# Altium project RP2350_OPCUA_Node.PrjPcb (part 1 of 2)
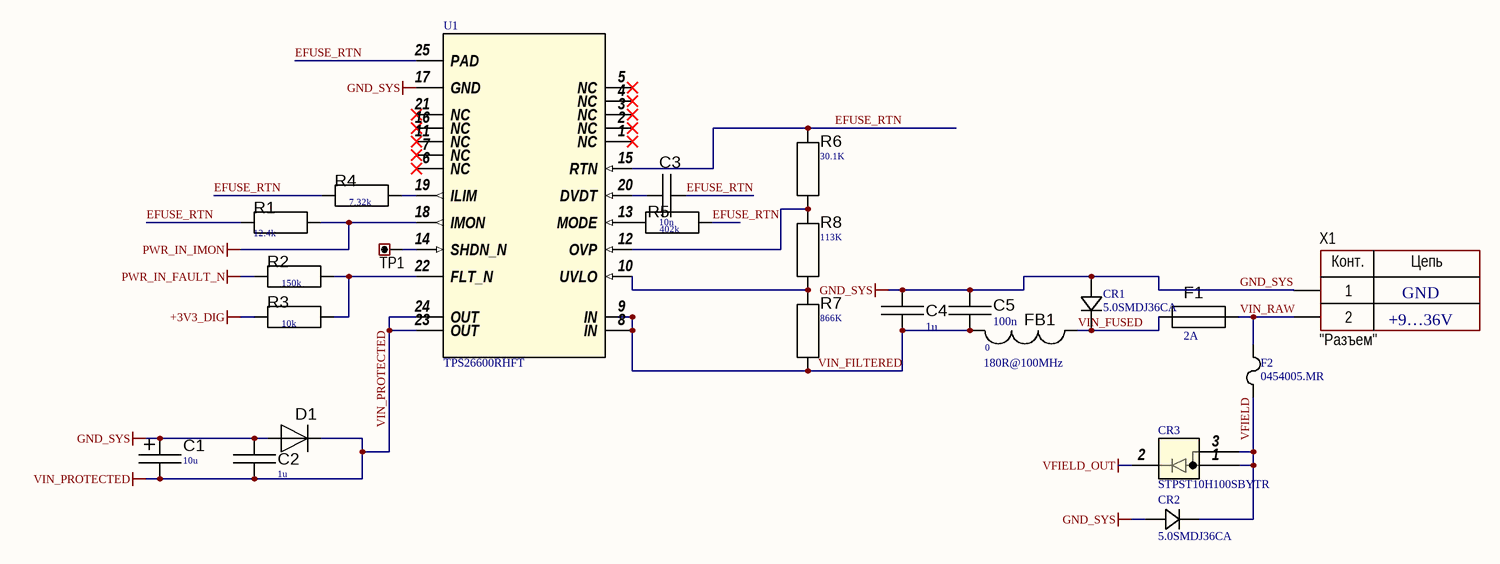
[diagram p0: 01_POWER_INPUT.SchDoc]
11 sheets, 419 parts. Net scope: global (net labels, ports and power ports of the same name join across sheets).
Board file: PCB1.PcbDoc
Sheets:
  01_POWER_INPUT.SchDoc
  02A_POWER_RAILS.SchDoc
  03_MCU_RP2350.SchDoc
  04_MEMORY.SchDoc
  05_ETHERNET_USB.SchDoc
  06_RS485.SchDoc
  07_ANALOG_INPUTS.SchDoc
  08_ANALOG_OUTPUTS.SchDoc
  09_DIGITAL_IO.SchDoc
  10_UNIVERSAL_INPUTS.SchDoc
  11_LEDS.SchDoc

## Sheet 01_POWER_INPUT.SchDoc: Схема электрическая принципиальная
size 420 x 297 mm; Date: 26.10.2026; ApprovedBy: Скрябин; CheckedBy: Скрябин; Author: Корсунов; CompanyName: РТУ МИРЭА; DocumentNumber: RP23.000001.001 Э3; Revision: 1; SheetNumber: 1; SheetTotal: 11; PageSetup: Record=PageOptions|CenterHorizontal=True|CenterVertical=True|PrintScale=0.94|XCorrection=1.00|YCorrection=1.00|PrintKind=1|BorderSize=5000000|LeftOffset=0|BottomOffset=0|Orientation=1|PaperLength=1000|PaperWidth=1000|Scale=100|PaperSource=7|PrintQuality=-4|MediaType=1|DitherType=10|PaperKind=A4|PrintScaleMode=1; DecimalNumber: RP23.000001.001; Name1: Модуль ввода-вывода; lit_A: О; Name2: RP2350 OPC UA

### Parts
C1  value 10u  [C_SMD_Al_D]  (hidden comment: Capacitor)
C2  value 1u  [C_1206]  (hidden comment: Capacitor)
C3  value 10n  [C_0603]  (hidden comment: Capacitor)
C4  value 1u  [C_1206]  (hidden comment: Capacitor)
C5  value 100n  [C_0805]  (hidden comment: Capacitor)
CR1  5.0SMDJ36CA  [5.0SMDJSeries_LTF]
CR2  5.0SMDJ36CA  [5.0SMDJSeries_LTF]
CR3  STPST10H100SBYTR  [DPAK_STM]
D1  Schottky Diode  [SMC]  (value not drawn)
F1  CURRENT: 2A  [0454Series_LTF]  (hidden comment: Fuse)
F2  0454005.MR  [0454Series_LTF]
FB1  180R@100MHz  value 0  [L_0805]
R1  value 12.4k  [R_0603]  (hidden comment: Resistor)
R2  value 150k  [R_0805]  (hidden comment: Resistor)
R3  value 10k  [R_0805]  (hidden comment: Resistor)
R4  value 7.32k  [R_0805]  (hidden comment: Resistor)
R5  value 402k  [R_0805]  (hidden comment: Resistor)
R6  value 30.1K  [R_0805]  (hidden comment: Resistor)
R7  value 866K  [R_0805]  (hidden comment: Resistor)
R8  value 113K  [R_0805]  (hidden comment: Resistor)
TP1  (no value)  [CON: 5000 (Keystone)]
U1  TPS26600RHFT  [RHF0024A]
X1  CommentText: "Разъем"  [CON: DG350-3.5-02P]

### Nets
+3V3_DIG: R3.1
GND_SYS: C1.2 C2.2 C4.2 C5.2 CR1.2 CR2.2 D1.1(A) U1.17(GND) X1.1
PWR_IN_FAULT_N: R2.1
PWR_IN_IMON: R1.2 U1.18(IMON)
VFIELD_OUT: CR3.2(CATHODE)
VIN_PROTECTED: C1.1 C2.1 D1.2(C) U1.23(OUT) U1.24(OUT)
EFUSE_RTN: C3.1 R1.1 R4.1 R5.2 R6.2 U1.15(RTN) U1.25(PAD)
VFIELD: CR2.1 CR3.1(ANODE) CR3.3(ANODE) F2.1
VIN_FILTERED: C4.1 C5.1 FB1.2 R7.1 U1.8(IN) U1.9(IN)
VIN_FUSED: CR1.1 F1.1 FB1.1
VIN_RAW: F1.2 F2.2 X1.2
NetC3_2: C3.2 U1.20(DVDT)
NetR2_2: R2.2 R3.2 U1.22(FLT_N)
NetR4_2: R4.2 U1.19(ILIM)
NetR5_1: R5.1 U1.13(MODE)
NetR6_1: R6.1 R8.2 U1.12(OVP)
NetR7_2: R7.2 R8.1 U1.10(UVLO)
NetTP1_1: TP1.1 U1.14(SHDN_N)

Not connected (* = marked no-connect by the designer): U1 1(NC)* 2(NC)* 3(NC)* 4(NC)* 5(NC)* 6(NC)* 7(NC)* 11(NC)* 16(NC)* 21(NC)*

### Notes on the sheet
- GND
- +9…36V
- Перв.примен.
- Справ.№
- Подп. и дата
- Инв.№ дубл.
- Взам.инв.№
- Подп.и дата
- Разраб.
- Изм.
- Лист
- № докум.
- Подп.
- Дата
- Лит.
- Масштаб
- Масса
- Т.контр.
- Пров.
- СХЕМА   ЭЛЕКТРИЧЕСКАЯ
- ПРИНЦИПИАЛЬНАЯ
- Листов
- Инв.№ подл.
- Утв.
- Н.контр.
- Нач.сект.
- Формат  A3
- (in symbol Connector_terminal_2pin) Конт.; Цепь

### Library data of the parts
C1-C5 = Capacitor: SimulationGenericComponent: True
CR1 CR2 = 5.0SMDJ36CA: No Description Available; Manufacturer_Name: Littelfuse Inc; Copyright: Copyright (C) 2026 Ultra Librarian. All rights reserved.; Manufacturer_Part_Number: 5.0SMDJ36CA
CR3 = STPST10H100SBYTR: Automotive 100 V, 10 A, DPAK Power Schottky Trench Rectifier; Manufacturer_Name: STMicroelectronics; Copyright: Copyright (C) 2026 Ultra Librarian. All rights reserved.; Manufacturer_Part_Number: STPST10H100SBYTR; Datasheet: https://www.st.com/resource/en/datasheet/stpst10h100sb-y.pdf; RefDes: RefDes; Type: Type
D1 = Schottky Diode: AF: 1; BV: 0; BV_MAX: 1e99; EG: 1.11; FC: 0.5; IBV: 0.001; IS: 1e-14; MJSW: 0.33; NTUN: 30; TNOM: 27; XTI: 3; SimulationGenericComponent: True; CJO: 0; CJP: 0; CTA: 0; CTP: 0; FCS: 0.5; FV_MAX: 1e99; IKF: 0; IKR: 0; ISR: 1e-14; JSW: 0; JTUN: 0; JTUNSW: 0; KEG: 1; KF: 0; LEVEL: 1; N: 1; NBV: 1; NR: 1; NS: 1; PHP: 1; RS: 0; TCV: 0; TLEV: 0; TLEVC: 0; TM1: 0; TM2: 0; TPB: 0; TPHP: 0; TRS: 0; TRS2: 0; TT: 0; TTT1: 0; TTT2: 0; VJ: 1; XTITUN: 3
F1 = Fuse: RESISTANCE: 1m; SimulationGenericComponent: True
F2 = 0454005.MR: No Description Available; Manufacturer_Name: Littelfuse Inc; Copyright: Copyright (C) 2026 Ultra Librarian. All rights reserved.; Manufacturer_Part_Number: 0454005.MR
FB1 = Resistor: SimulationGenericComponent: True; TC1: 0; TC2: 0
R1-R8 = Resistor: TC1: 0; SimulationGenericComponent: True; TC2: 0
TP1 = Connector_Test_Point: Manufacturer: Keystone; ValueManufacturerPartNumber: Test point, Keystone, 5001; PartNumber: 5001; TypeConnector: Test point; HelpURL: https://www.digikey.com/product-detail/en/keystone-electronics/5001/36-5001-ND/255327
U1 = TPS26600RHFT: 4.2-V to 60-V, 150m&Omega;, 0.1-2.23A eFuse with integrated input reverse polarity protection 24-VQFN -40 to 125; Manufacturer_Name: Texas Instruments; TYPE: TYPE; RefDes: RefDes; Copyright: Copyright (C) 2026 Ultra Librarian. All rights reserved.; Manufacturer_Part_Number: TPS26600RHFT; Datasheet: https://www.ti.com/lit/gpn/tps2660
X1 = Connector_terminal_2pin: Manufacturer: Degson; ValueManufacturerPartNumber: Terminal connector, 2pin, 3.5mm, 300VAC, 10A; PartNumber: DG350-3.5-02P-14; TypeConnector: Terminal connector; VoltageMax: 300VAC; Pitch: 3.5mm; CurrentMax: 10A; Multichannel: 2pin; HelpURL: https://www.chipdip.ru/product/dg350-3.5-02p-12

## Sheet 02A_POWER_RAILS.SchDoc: Схема электрическая принципиальная
size 420 x 297 mm; ApprovedBy: Скрябин; CheckedBy: Скрябин; Author: Корсунов; CompanyName: РТУ МИРЭА; SheetNumber: 2; SheetTotal: 11; PageSetup: Record=PageOptions|CenterHorizontal=True|CenterVertical=True|PrintScale=0.94|XCorrection=1.00|YCorrection=1.00|PrintKind=1|BorderSize=5000000|LeftOffset=0|BottomOffset=0|Orientation=1|PaperLength=1000|PaperWidth=1000|Scale=100|PaperSource=7|PrintQuality=-4|MediaType=1|DitherType=10|PaperKind=A4|PrintScaleMode=1; DecimalNumber: RP23.000001.002 Э3; Name1: Модуль ввода-вывода; lit_A: О; Name2: RP2350 OPC UA
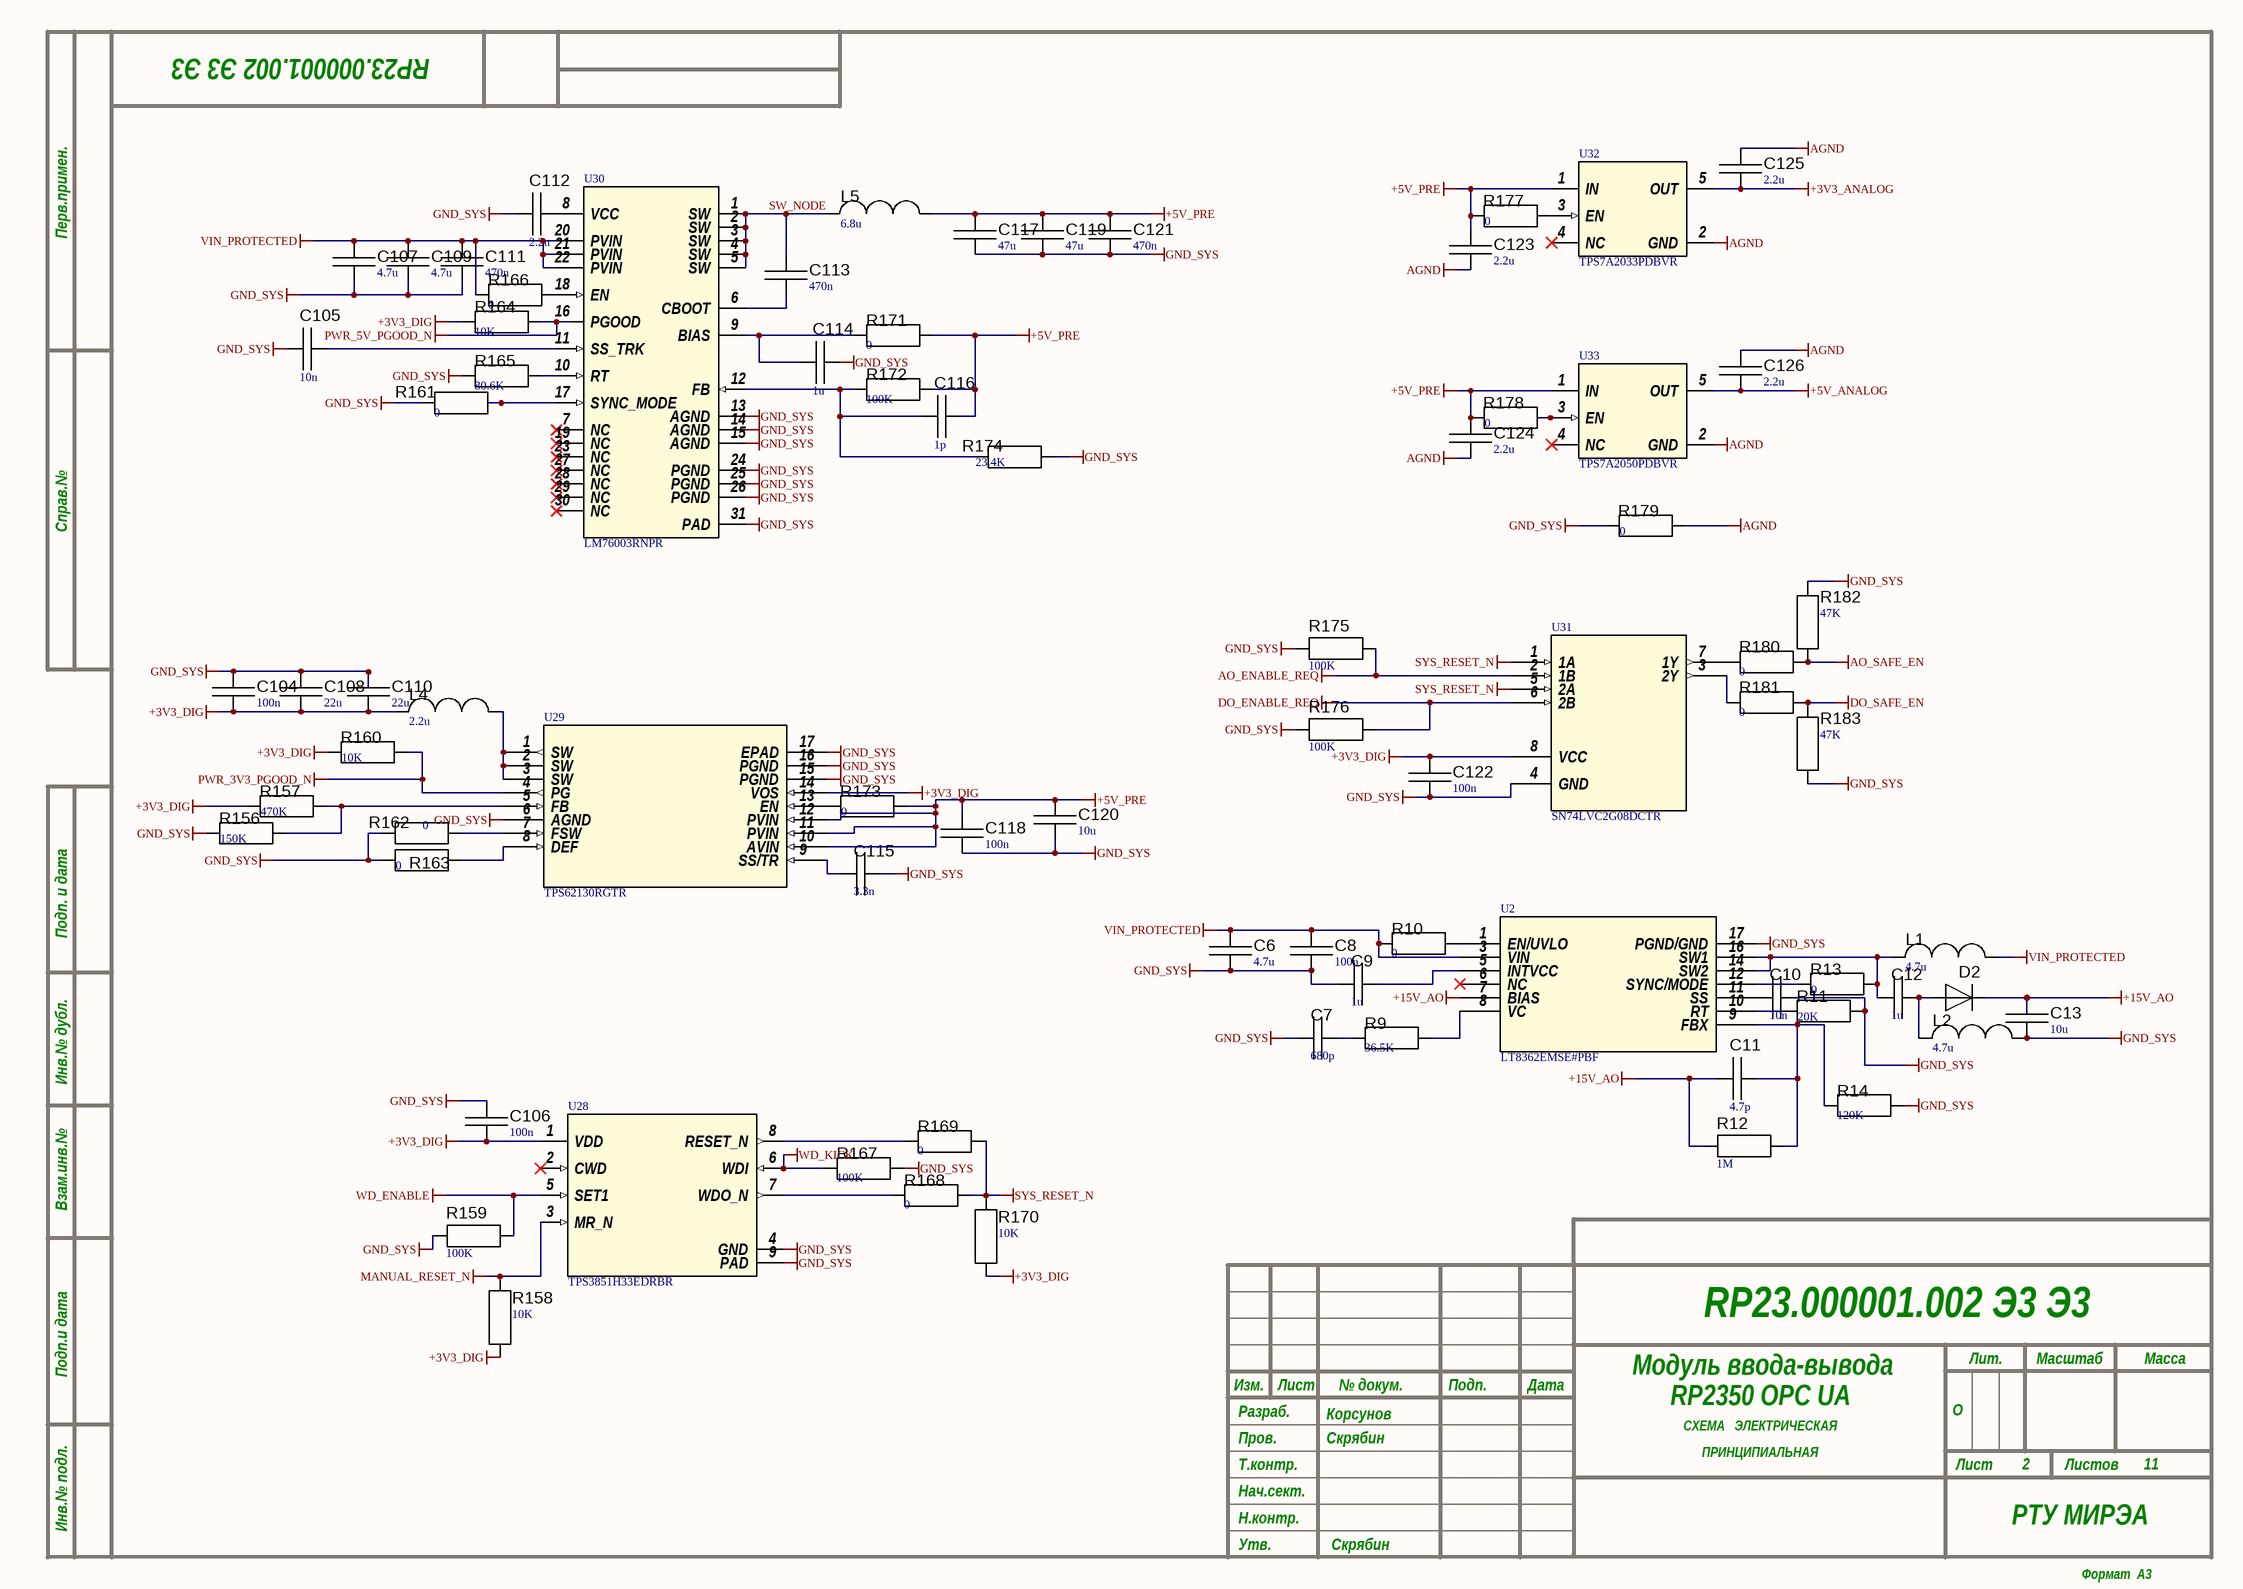
[diagram p1: 02A_POWER_RAILS.SchDoc]

### Parts
C6  value 4.7u  [C_1206]  (hidden comment: Capacitor)
C7  value 680p  [C_0603]  (hidden comment: Capacitor)
C8  value 100n  [C_0805]  (hidden comment: Capacitor)
C9  value 1u  [C_0603]  (hidden comment: Capacitor)
C10  value 10n  [C_0603]  (hidden comment: Capacitor)
C11  value 4.7p  [C_0603]  (hidden comment: Capacitor)
C12  value 1u  [C_1206]  (hidden comment: Capacitor)
C13  value 10u  [C_1206]  (hidden comment: Capacitor)
C104  value 100n  [C_0805]  (hidden comment: Capacitor)
C105  value 10n  [C_0603]  (hidden comment: Capacitor)
C106  value 100n  [C_0805]  (hidden comment: Capacitor)
C107  value 4.7u  [C_1206]  (hidden comment: Capacitor)
C108  value 22u  [C_1210]  (hidden comment: Capacitor)
C109  value 4.7u  [C_1206]  (hidden comment: Capacitor)
C110  value 22u  [C_1210]  (hidden comment: Capacitor)
C111  value 470n  [C_0805]  (hidden comment: Capacitor)
C112  value 2.2u  [C_0603]  (hidden comment: Capacitor)
C113  value 470n  [C_0805]  (hidden comment: Capacitor)
C114  value 1u  [C_0603]  (hidden comment: Capacitor)
C115  value 3.3n  [C_0603]  (hidden comment: Capacitor)
C116  value 1p  [C_0603]  (hidden comment: Capacitor)
C117  value 47u  [C_1210]  (hidden comment: Capacitor)
C118  value 100n  [C_0805]  (hidden comment: Capacitor)
C119  value 47u  [C_1210]  (hidden comment: Capacitor)
C120  value 10u  [C_1206]  (hidden comment: Capacitor)
C121  value 470n  [C_0805]  (hidden comment: Capacitor)
C122  value 100n  [C_0805]  (hidden comment: Capacitor)
C123  value 2.2u  [C_0603]  (hidden comment: Capacitor)
C124  value 2.2u  [C_0603]  (hidden comment: Capacitor)
C125  value 2.2u  [C_0603]  (hidden comment: Capacitor)
C126  value 2.2u  [C_0603]  (hidden comment: Capacitor)
D2  Schottky Diode  [D_POWERDI123]  (value not drawn)
L1  value 4.7u  [L_XGL4020]  (hidden comment: Inductor)
L2  value 4.7u  [L_XGL4020]  (hidden comment: Inductor)
L4  value 2.2u  [L_XFL4020]  (hidden comment: Inductor)
L5  value 6.8u  [L_XGL6030]  (hidden comment: Inductor)
R9  value 36.5K  [R_0805]  (hidden comment: Resistor)
R10  value 0  [R_0805]  (hidden comment: Resistor)
R11  value 20K  [R_0805]  (hidden comment: Resistor)
R12  value 1M  [R_0805]  (hidden comment: Resistor)
R13  value 0  [R_0805]  (hidden comment: Resistor)
R14  value 120K  [R_0805]  (hidden comment: Resistor)
R156  value 150K  [R_0805]  (hidden comment: Resistor)
R157  value 470K  [R_0805]  (hidden comment: Resistor)
R158  value 10K  [R_0805]  (hidden comment: Resistor)
R159  value 100K  [R_0805]  (hidden comment: Resistor)
R160  value 10K  [R_0805]  (hidden comment: Resistor)
R161  value 0  [R_0805]  (hidden comment: Resistor)
R162  value 0  [R_0805]  (hidden comment: Resistor)
R163  value 0  [R_0805]  (hidden comment: Resistor)
R164  value 10K  [R_0805]  (hidden comment: Resistor)
R165  value 80.6K  [R_0805]  (hidden comment: Resistor)
R166  value 0  [R_0805]  (hidden comment: Resistor)
R167  value 100K  [R_0805]  (hidden comment: Resistor)
R168  value 0  [R_0805]  (hidden comment: Resistor)
R169  value 0  [R_0805]  (hidden comment: Resistor)
R170  value 10K  [R_0805]  (hidden comment: Resistor)
R171  value 0  [R_0805]  (hidden comment: Resistor)
R172  value 100K  [R_0805]  (hidden comment: Resistor)
R173  value 0  [R_0805]  (hidden comment: Resistor)
R174  value 23.4K  [R_0805]  (hidden comment: Resistor)
R175  value 100K  [R_0805]  (hidden comment: Resistor)
R176  value 100K  [R_0805]  (hidden comment: Resistor)
R177  value 0  [R_0805]  (hidden comment: Resistor)
R178  value 0  [R_0805]  (hidden comment: Resistor)
R179  value 0  [R_0805]  (hidden comment: Resistor)
R180  value 0  [R_0805]  (hidden comment: Resistor)
R181  value 0  [R_0805]  (hidden comment: Resistor)
R182  value 47K  [R_0805]  (hidden comment: Resistor)
R183  value 47K  [R_0805]  (hidden comment: Resistor)
U2  LT8362EMSE#PBF  [MSE_16A_ADI]
U28  TPS3851H33EDRBR  [DRB0008A]
U29  TPS62130RGTR  [RGT16_1P7X1P7]
U30  LM76003RNPR  [RNP0030B]
U31  SN74LVC2G08DCTR  [DCT8]
U32  TPS7A2033PDBVR  [DBV0005A-IPC_A]
U33  TPS7A2050PDBVR  [DBV0005A-IPC_A]

### Nets
+3V3_ANALOG: C125.1 U32.5(OUT)
+3V3_DIG: C104.1 C106.1 C108.1 C110.1 C122.2 L4.1 R157.1 R158.1 R160.1 R164.1 R170.1 U28.1(VDD) U29.14(VOS) U31.8(VCC)
+5V_ANALOG: C126.1 U33.5(OUT)
+5V_PRE: C116.1 C117.2 C118.1 C119.2 C120.1 C121.2 C123.2 C124.2 L5.2 R171.2 R172.2 R173.2 R177.1 R178.1 U29.10(AVIN) U29.11(PVIN) U29.12(PVIN) U32.1(IN) U33.1(IN)
+15V_AO: C11.2 C13.2 D2.2(C) R12.2 U2.7(BIAS)
AGND: C123.1 C124.1 C125.2 C126.2 R179.2 U32.2(GND) U33.2(GND)
AO_ENABLE_REQ: R175.1 U31.2(1B)
AO_SAFE_EN: R180.2 R182.1
DO_ENABLE_REQ: R176.1 U31.6(2B)
DO_SAFE_EN: R181.2 R183.2
GND_SYS: C6.1 C7.1 C8.1 C9.1 C10.2 C13.1 C104.2 C105.2 C106.2 C107.1 C108.2 C109.1 C110.2 C111.1 C112.2 C114.1 C115.2 C117.1 C118.2 C119.1 C120.2 C121.1 C122.1 L2.2 R11.2 R14.2 R156.1 R159.2 R161.1 R162.1 R163.1 R165.1 R167.2 R174.2 R175.2 R176.2 R179.1 R182.2 R183.1 U2.17(PGND/GND) U28.4(GND) U28.9(PAD) U29.6(AGND) U29.15(PGND) U29.16(PGND) U29.17(EPAD) U30.13(AGND) U30.14(AGND) U30.15(AGND) U30.24(PGND) U30.25(PGND) U30.26(PGND) U30.31(PAD) U31.4(GND)
MANUAL_RESET_N: R158.2 U28.3(MR_N)
PWR_3V3_PGOOD_N: R160.2 U29.4(PG)
PWR_5V_PGOOD_N: R164.2 U30.16(PGOOD)
SYS_RESET_N: R168.2 R169.2 R170.2 U31.1(1A) U31.5(2A)
VIN_PROTECTED: C6.2 C8.2 C107.2 C109.2 C111.2 L1.2 R10.1 R166.1 U2.3(VIN) U30.20(PVIN) U30.21(PVIN) U30.22(PVIN)
WD_ENABLE: R159.1 U28.5(SET1)
WD_KICK: R167.1 U28.6(WDI)
SW_NODE: C113.2 L5.1 U30.1(SW) U30.2(SW) U30.3(SW) U30.4(SW) U30.5(SW)
NetC7_2: C7.2 R9.1
NetC9_2: C9.2 U2.5(INTVCC)
NetC10_1: C10.1 U2.11(SS)
NetC11_1: C11.1 R12.1 R14.1 U2.9(FBX)
NetC12_1: C12.1 L1.1 R13.2 U2.14(SW2) U2.16(SW1)
NetC12_2: C12.2 D2.1(A) L2.1
NetC105_1: C105.1 U30.11(SS_TRK)
NetC112_1: C112.1 U30.8(VCC)
NetC113_1: C113.1 U30.6(CBOOT)
NetC114_2: C114.2 R171.1 U30.9(BIAS)
NetC115_1: C115.1 U29.9(SS/TR)
NetC116_2: C116.2 R172.1 R174.1 U30.12(FB)
NetL4_2: L4.2 U29.1(SW) U29.2(SW) U29.3(SW)
NetR9_2: R9.2 U2.8(VC)
NetR10_2: R10.2 U2.1(EN/UVLO)
NetR11_1: R11.1 U2.10(RT)
NetR13_1: R13.1 U2.12(SYNC/MODE)
NetR156_2: R156.2 R157.2 U29.5(FB)
NetR161_2: R161.2 U30.17(SYNC_MODE)
NetR162_2: R162.2 U29.7(FSW)
NetR163_2: R163.2 U29.8(DEF)
NetR165_2: R165.2 U30.10(RT)
NetR166_2: R166.2 U30.18(EN)
NetR168_1: R168.1 U28.7(WDO_N)
NetR169_1: R169.1 U28.8(RESET_N)
NetR173_1: R173.1 U29.13(EN)
NetR177_2: R177.2 U32.3(EN)
NetR178_2: R178.2 U33.3(EN)
NetR180_1: R180.1 U31.7(1Y)
NetR181_1: R181.1 U31.3(2Y)

Not connected (* = marked no-connect by the designer): U2 6(NC)*; U28 2(CWD)*; U30 7(NC)* 19(NC)* 23(NC)* 27(NC)* 28(NC)* 29(NC)* 30(NC)*; U32 4(NC)*; U33 4(NC)*

### Notes on the sheet
- Перв.примен.
- Справ.№
- Подп. и дата
- Инв.№ дубл.
- Взам.инв.№
- Подп.и дата
- Разраб.
- Изм.
- Лист
- № докум.
- Подп.
- Дата
- Лит.
- Масштаб
- Масса
- Т.контр.
- Пров.
- СХЕМА   ЭЛЕКТРИЧЕСКАЯ
- ПРИНЦИПИАЛЬНАЯ
- Листов
- Инв.№ подл.
- Утв.
- Н.контр.
- Нач.сект.
- Формат  A3

### Library data of the parts
C6-C13 C104-C126 = Capacitor: SimulationGenericComponent: True
D2 = Schottky Diode: as D1 on sheet 01_POWER_INPUT; CJO: 0; CJP: 0; CTA: 0; CTP: 0; FCS: 0.5; FV_MAX: 1e99; IKF: 0; IKR: 0; ISR: 1e-14; JSW: 0; JTUN: 0; JTUNSW: 0; KEG: 1; KF: 0; LEVEL: 1; N: 1; NBV: 1; NR: 1; NS: 1; PHP: 1; RS: 0; TCV: 0; TLEV: 0; TLEVC: 0; TM1: 0; TM2: 0; TPB: 0; TPHP: 0; TRS: 0; TRS2: 0; TT: 0; TTT1: 0; TTT2: 0; VJ: 1; XTITUN: 3
L1 L2 L4 L5 = Inductor: SimulationGenericComponent: True
R9 R11 R12 R14 R156-R160 R164 R165 R167 R170 R172 R174-R176 R182 R183 = Resistor: TC1: 0; SimulationGenericComponent: True; TC2: 0
R10 R13 R161-R163 R166 R168 R169 R171 R173 R177-R181 = Resistor: SimulationGenericComponent: True; TC1: 0; TC2: 0
U2 = LT8362EMSEPBF: Low IQ Boost/SEPIC/Inverting Converter with 2A, 60V Switch; Manufacturer_Name: Analog Devices Inc; Copyright: Copyright (C) 2026 Ultra Librarian. All rights reserved.; Manufacturer_Part_Number: LT8362EMSE#PBF; Datasheet: https://www.analog.com/media/en/technical-documentation/data-sheets/lt8362.pdf; RefDes: RefDes; Type: Type
U28 = TPS3851H33EDRBR: High-accuracy voltage supervisor with Integrated watchdog timer 8-SON -40 to 125; Manufacturer_Name: Texas Instruments; TYPE: TYPE; RefDes: RefDes; Copyright: Copyright (C) 2026 Ultra Librarian. All rights reserved.; Manufacturer_Part_Number: TPS3851H33EDRBR; Datasheet: https://www.ti.com/lit/gpn/tps3851
U29 = TPS62130RGTR: 3-17V 3A Step-Down Converter with DCS-Control in 3x3 QFN Package 16-VQFN -40 to 125; Manufacturer_Name: Texas Instruments; Copyright: Copyright (C) 2026 Ultra Librarian. All rights reserved.; Manufacturer_Part_Number: TPS62130RGTR; Datasheet: https://www.ti.com/lit/gpn/tps62130; RefDes: RefDes; Type: Type
U30 = LM76003RNPR: 3.5V to 60V, 3.5A Synchronous Step-Down Voltage Converter 30-WQFN -40 to 125; Manufacturer_Name: Texas Instruments; TYPE: TYPE; RefDes: RefDes; Copyright: Copyright (C) 2025 Ultra Librarian. All rights reserved.; Manufacturer_Part_Number: LM76003RNPR
U31 = SN74LVC2G08DCTR: 2-ch, 2-input 1.65-V to 5.5-V 32 mA drive strength AND gate 8-SSOP -40 to 125; Manufacturer_Name: Texas Instruments; Copyright: Copyright (C) 2026 Ultra Librarian. All rights reserved.; Manufacturer_Part_Number: SN74LVC2G08DCTR; RefDes: RefDes; Type: Type
U32 = TPS7A2033PDBVR: 300mA ultra-low-noise low-IQ low-dropout (LDO) linear regulator with high PSRR 5-SOT-23 -40 to 125; Manufacturer_Name: Texas Instruments; TYPE: TYPE; RefDes: RefDes; Copyright: Copyright (C) 2026 Ultra Librarian. All rights reserved.; Manufacturer_Part_Number: TPS7A2033PDBVR
U33 = TPS7A2050PDBVR: 300mA ultra-low-noise low-IQ low-dropout (LDO) linear regulator with high PSRR 5-SOT-23 -40 to 125; Manufacturer_Name: Texas Instruments; TYPE: TYPE; RefDes: RefDes; Copyright: Copyright (C) 2025 Ultra Librarian. All rights reserved.; Manufacturer_Part_Number: TPS7A2050PDBVR

## Sheet 03_MCU_RP2350.SchDoc: Схема электрическая принципиальная
size 420 x 297 mm; ApprovedBy: Скрябин; CheckedBy: Скрябин; Author: Корсунов; CompanyName: РТУ МИРЭА; SheetNumber: 3; SheetTotal: 11; PageSetup: Record=PageOptions|CenterHorizontal=True|CenterVertical=True|PrintScale=0.94|XCorrection=1.00|YCorrection=1.00|PrintKind=1|BorderSize=5000000|LeftOffset=0|BottomOffset=0|Orientation=1|PaperLength=1000|PaperWidth=1000|Scale=100|PaperSource=7|PrintQuality=-4|MediaType=1|DitherType=10|PaperKind=A4|PrintScaleMode=1; DecimalNumber: RP23.000001.003 Э3; Name1: Модуль ввода-вывода; lit_A: О; Name2: RP2350 OPC UA
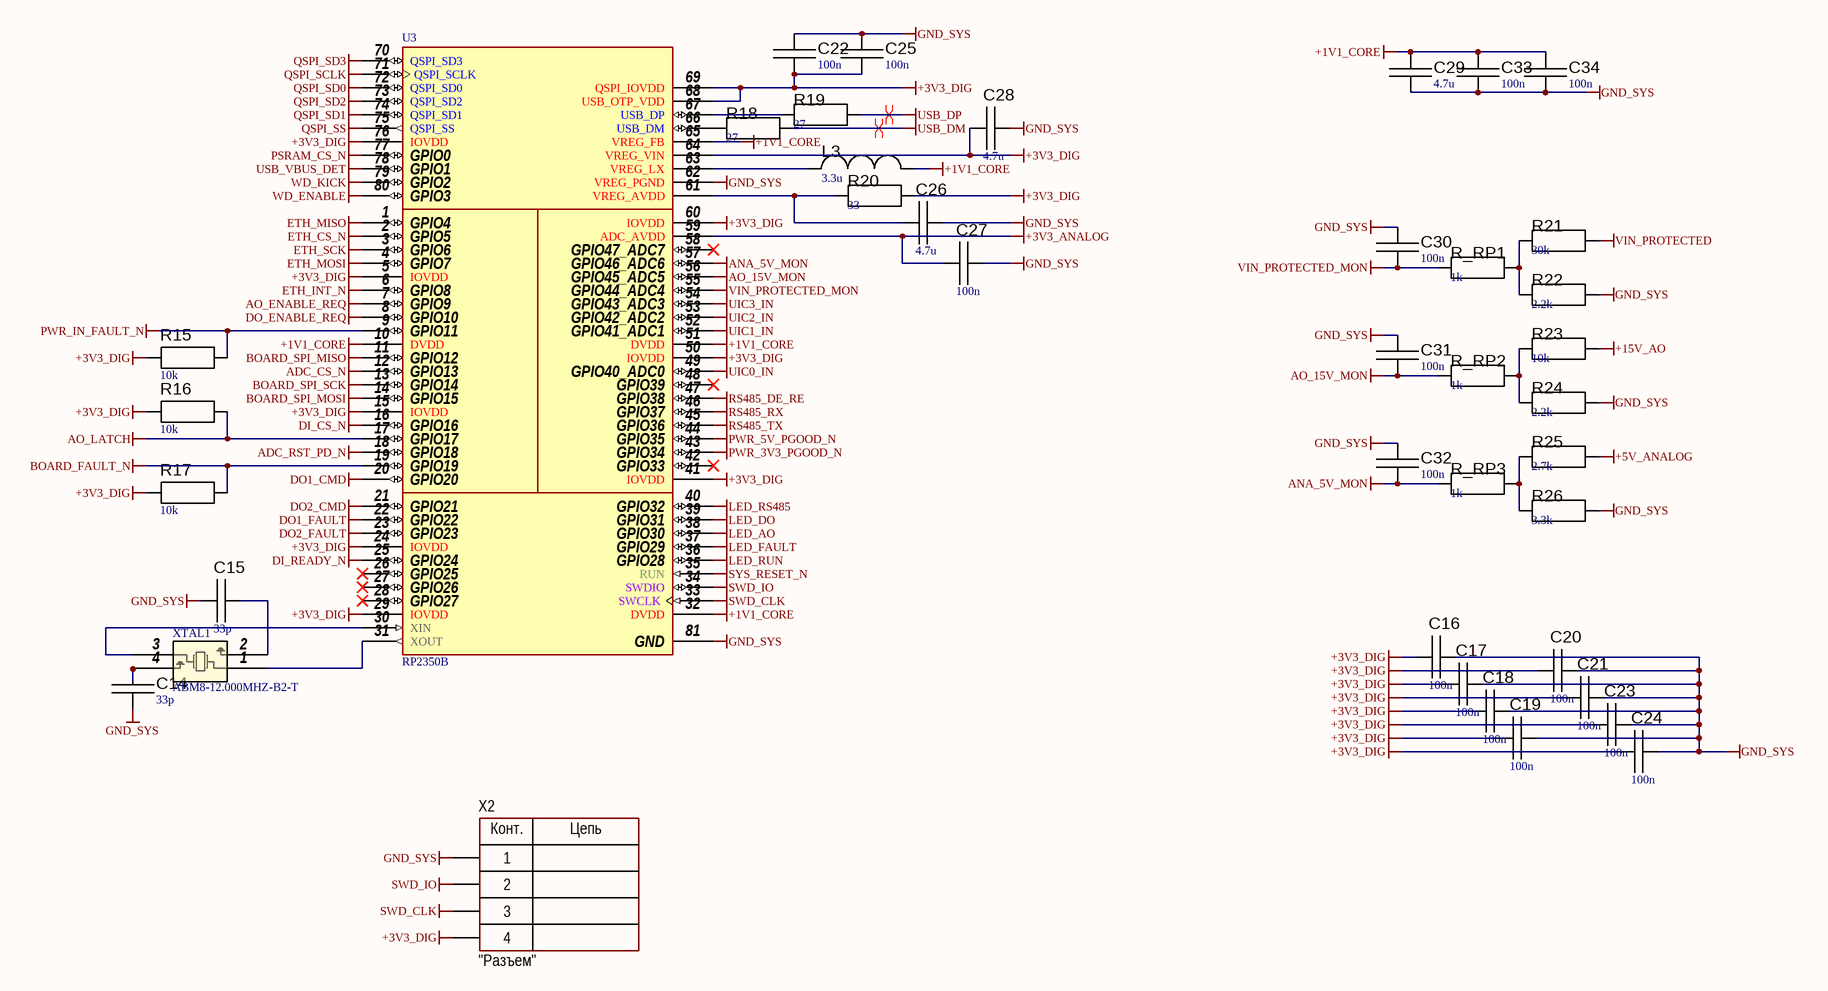
[diagram p2: 03_MCU_RP2350.SchDoc]

### Parts
C14  value 33p  [C_0603]  (hidden comment: Capacitor)
C15  value 33p  [C_0603]  (hidden comment: Capacitor)
C16  value 100n  [C_0603]  (hidden comment: Capacitor)
C17  value 100n  [C_0603]  (hidden comment: Capacitor)
C18  value 100n  [C_0603]  (hidden comment: Capacitor)
C19  value 100n  [C_0603]  (hidden comment: Capacitor)
C20  value 100n  [C_0603]  (hidden comment: Capacitor)
C21  value 100n  [C_0603]  (hidden comment: Capacitor)
C22  value 100n  [C_0603]  (hidden comment: Capacitor)
C23  value 100n  [C_0603]  (hidden comment: Capacitor)
C24  value 100n  [C_0603]  (hidden comment: Capacitor)
C25  value 100n  [C_0603]  (hidden comment: Capacitor)
C26  value 4.7u  [C_1206]  (hidden comment: Capacitor)
C27  value 100n  [C_0603]  (hidden comment: Capacitor)
C28  value 4.7u  [C_1206]  (hidden comment: Capacitor)
C29  value 4.7u  [C_1206]  (hidden comment: Capacitor)
C30  value 100n  [C_0603]  (hidden comment: Capacitor)
C31  value 100n  [C_0603]  (hidden comment: Capacitor)
C32  value 100n  [C_0603]  (hidden comment: Capacitor)
C33  value 100n  [C_0603]  (hidden comment: Capacitor)
C34  value 100n  [C_0603]  (hidden comment: Capacitor)
L3  value 3.3u  [L_AOTA_B201610]  (hidden comment: Inductor)
R15  value 10k  [R_0603]  (hidden comment: Resistor)
R16  value 10k  [R_0603]  (hidden comment: Resistor)
R17  value 10k  [R_0603]  (hidden comment: Resistor)
R18  value 27  [R_0603]  (hidden comment: Resistor)
R19  value 27  [R_0603]  (hidden comment: Resistor)
R20  value 33  [R_0603]  (hidden comment: Resistor)
R21  value 30k  [R_0603]  (hidden comment: Resistor)
R22  value 2.2k  [R_0603]  (hidden comment: Resistor)
R23  value 10k  [R_0603]  (hidden comment: Resistor)
R24  value 2.2k  [R_0603]  (hidden comment: Resistor)
R25  value 2.7k  [R_0603]  (hidden comment: Resistor)
R26  value 3.3k  [R_0603]  (hidden comment: Resistor)
R_RP1  value 1k  [R_0603]  (hidden comment: Resistor)
R_RP2  value 1k  [R_0603]  (hidden comment: Resistor)
R_RP3  value 1k  [R_0603]  (hidden comment: Resistor)
U3  RP2350B  [QFN40P1000X1000X85-81N]
X2  CommentText: "Разъем"  [CON: WF-04]
XTAL1  ABM8-12.000MHZ-B2-T  [ABM8_ABR]

### Nets
+1V1_CORE: C29.2 C33.2 C34.2 L3.2 U3.10(DVDD) U3.32(DVDD) U3.51(DVDD) U3.65(VREG_FB)
+3V3_ANALOG: C27.2 U3.59(ADC_AVDD)
+3V3_DIG: C16.2 C17.2 C18.2 C19.2 C20.2 C21.2 C22.2 C23.2 C24.2 C25.2 C28.2 R15.2 R16.2 R17.2 R20.2 U3.5(IOVDD) U3.15(IOVDD) U3.24(IOVDD) U3.29(IOVDD) U3.41(IOVDD) U3.50(IOVDD) U3.60(IOVDD) U3.64(VREG_VIN) U3.68(USB_OTP_VDD) U3.69(QSPI_IOVDD) U3.76(IOVDD) X2.4
+5V_ANALOG: R25.2
+15V_AO: R23.2
ADC_CS_N: U3.12(GPIO13)
ADC_RST_PD_N: U3.18(GPIO18)
ANA_5V_MON: C32.2 R_RP3.1 U3.57(GPIO46_ADC6)
AO_15V_MON: C31.2 R_RP2.1 U3.56(GPIO45_ADC5)
AO_ENABLE_REQ: U3.7(GPIO9)
AO_LATCH: R16.1 U3.17(GPIO17)
BOARD_FAULT_N: R17.1 U3.19(GPIO19)
BOARD_SPI_MISO: U3.11(GPIO12)
BOARD_SPI_MOSI: U3.14(GPIO15)
BOARD_SPI_SCK: U3.13(GPIO14)
DI_CS_N: U3.16(GPIO16)
DI_READY_N: U3.25(GPIO24)
DO1_CMD: U3.20(GPIO20)
DO1_FAULT: U3.22(GPIO22)
DO2_CMD: U3.21(GPIO21)
DO2_FAULT: U3.23(GPIO23)
DO_ENABLE_REQ: U3.8(GPIO10)
ETH_CS_N: U3.2(GPIO5)
ETH_INT_N: U3.6(GPIO8)
ETH_MISO: U3.1(GPIO4)
ETH_MOSI: U3.4(GPIO7)
ETH_SCK: U3.3(GPIO6)
GND_SYS: C14.1 C15.2 C16.1 C17.1 C18.1 C19.1 C20.1 C21.1 C22.1 C23.1 C24.1 C25.1 C26.1 C27.1 C28.1 C29.1 C30.1 C31.1 C32.1 C33.1 C34.1 R22.2 R24.2 R26.2 U3.62(VREG_PGND) U3.81(GND) X2.1
LED_AO: U3.38(GPIO30)
LED_DO: U3.39(GPIO31)
LED_FAULT: U3.37(GPIO29)
LED_RS485: U3.40(GPIO32)
LED_RUN: U3.36(GPIO28)
PSRAM_CS_N: U3.77(GPIO0)
PWR_3V3_PGOOD_N: U3.43(GPIO34)
PWR_5V_PGOOD_N: U3.44(GPIO35)
PWR_IN_FAULT_N: R15.1 U3.9(GPIO11)
QSPI_SCLK: U3.71(QSPI_SCLK)
QSPI_SD0: U3.72(QSPI_SD0)
QSPI_SD1: U3.74(QSPI_SD1)
QSPI_SD2: U3.73(QSPI_SD2)
QSPI_SD3: U3.70(QSPI_SD3)
QSPI_SS: U3.75(QSPI_SS)
RS485_DE_RE: U3.47(GPIO38)
RS485_RX: U3.46(GPIO37)
RS485_TX: U3.45(GPIO36)
SWD_CLK: U3.33(SWCLK) X2.3
SWD_IO: U3.34(SWDIO) X2.2
SYS_RESET_N: U3.35(RUN)
UIC0_IN: U3.49(GPIO40_ADC0)
UIC1_IN: U3.52(GPIO41_ADC1)
UIC2_IN: U3.53(GPIO42_ADC2)
UIC3_IN: U3.54(GPIO43_ADC3)
USB_DM: R18.2
USB_DP: R19.2
USB_VBUS_DET: U3.78(GPIO1)
VIN_PROTECTED: R21.2
VIN_PROTECTED_MON: C30.2 R_RP1.1 U3.55(GPIO44_ADC4)
WD_ENABLE: U3.80(GPIO3)
WD_KICK: U3.79(GPIO2)
NetC14_2: C14.2 XTAL1.4
NetC15_1: C15.1 XTAL1.2
NetC26_2: C26.2 R20.1 U3.61(VREG_AVDD)
NetL3_1: L3.1 U3.63(VREG_LX)
NetR18_1: R18.1 U3.66(USB_DM)
NetR19_1: R19.1 U3.67(USB_DP)
NetR21_1: R21.1 R22.1 R_RP1.2
NetR23_1: R23.1 R24.1 R_RP2.2
NetR25_1: R25.1 R26.1 R_RP3.2
NetU3_30: U3.30(XIN) XTAL1.3
NetU3_31: U3.31(XOUT) XTAL1.1

Not connected (* = marked no-connect by the designer): U3 26(GPIO25)* 27(GPIO26)* 28(GPIO27)* 42(GPIO33)* 48(GPIO39)* 58(GPIO47_ADC7)*

### Layout directives
differential pair: USB_DM, USB_DP

### Notes on the sheet
- Перв.примен.
- Справ.№
- Подп. и дата
- Инв.№ дубл.
- Взам.инв.№
- Подп.и дата
- Разраб.
- Изм.
- Лист
- № докум.
- Подп.
- Дата
- Лит.
- Масштаб
- Масса
- Т.контр.
- Пров.
- СХЕМА   ЭЛЕКТРИЧЕСКАЯ
- ПРИНЦИПИАЛЬНАЯ
- Листов
- Инв.№ подл.
- Утв.
- Н.контр.
- Нач.сект.
- Формат  A3
- (in symbol WF-4) Конт.; Цепь

### Library data of the parts
C14-C34 = Capacitor: SimulationGenericComponent: True
L3 = Inductor: SimulationGenericComponent: True
R15-R26 R_RP1-R_RP3 = Resistor: TC1: 0; SimulationGenericComponent: True; TC2: 0
U3 = RP2350B: RP2350B Microcontroller from Raspberry Pi; ComponentLink1Description: Datasheet; ComponentLink1URL: https://datasheets.raspberrypi.com/rp2350/rp2350-datasheet.pdf
X2 = WF-4: Manufacturer: Connfly; ValueManufacturerPartNumber: Connector, 4pin, 2.54mm, 250VAC, 3A; TypeConnector: Connector; VoltageMax: 250VAC; Pitch: 2.54mm; CurrentMax: 3A; Multichannel: 4pin; HelpURL: https://www.chipdip.ru/product/wf-4; PartNumber: WF-4
XTAL1 = ABM8-12.000MHZ-B2-T: No Description Available; Manufacturer_Name: Abracon; Copyright: Copyright (C) 2026 Ultra Librarian. All rights reserved.; Manufacturer_Part_Number: ABM8-12.000MHZ-B2-T; RefDes: RefDes; Type: Type

## Sheet 04_MEMORY.SchDoc: Схема электрическая принципиальная
size 420 x 297 mm; ApprovedBy: Скрябин; CheckedBy: Скрябин; Author: Корсунов; CompanyName: РТУ МИРЭА; SheetNumber: 4; SheetTotal: 11; PageSetup: Record=PageOptions|CenterHorizontal=True|CenterVertical=True|PrintScale=0.94|XCorrection=1.00|YCorrection=1.00|PrintKind=1|BorderSize=5000000|LeftOffset=0|BottomOffset=0|Orientation=1|PaperLength=1000|PaperWidth=1000|Scale=100|PaperSource=7|PrintQuality=-4|MediaType=1|DitherType=10|PaperKind=A4|PrintScaleMode=1; DecimalNumber: RP23.000001.004 Э3; Name1: Модуль ввода-вывода; lit_A: О; Name2: RP2350 OPC UA
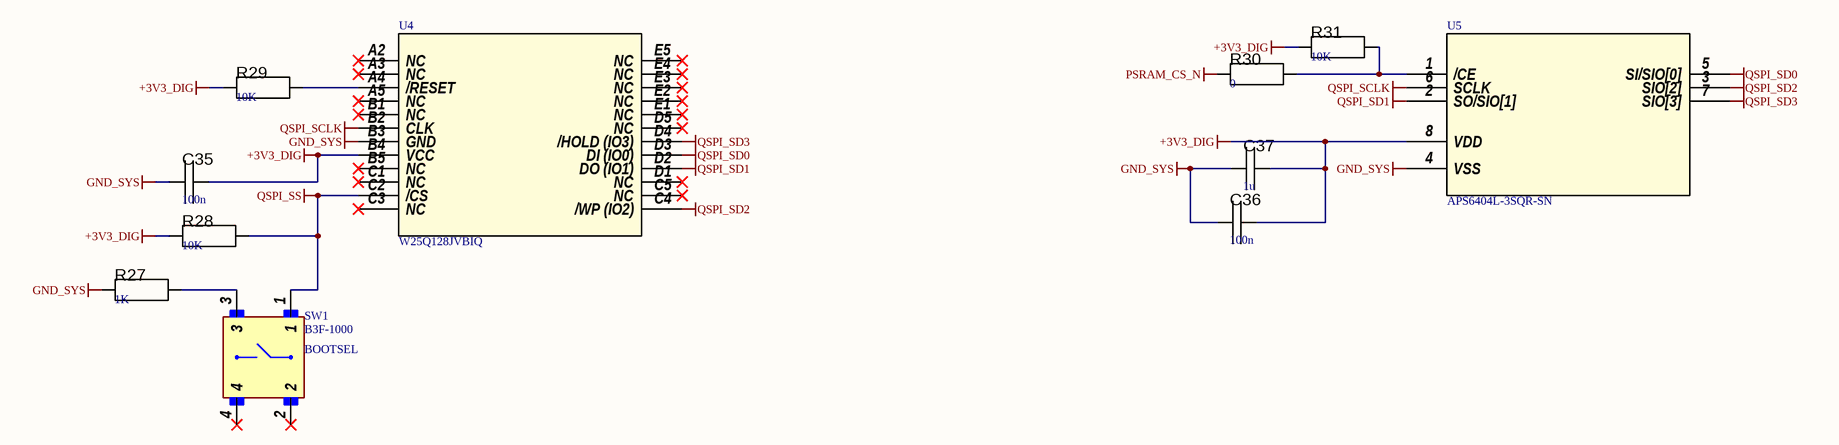
[diagram p3: 04_MEMORY.SchDoc]

### Parts
C35  value 100n  [C_0603]  (hidden comment: Capacitor)
C36  value 100n  [C_0603]  (hidden comment: Capacitor)
C37  value 1u  [C_0603]  (hidden comment: Capacitor)
R27  value 1K  [R_0603]  (hidden comment: Resistor)
R28  value 10K  [R_0603]  (hidden comment: Resistor)
R29  value 10K  [R_0603]  (hidden comment: Resistor)
R30  value 0  [R_0603]  (hidden comment: Resistor)
R31  value 10K  [R_0603]  (hidden comment: Resistor)
SW1  B3F-1000  [SW_B3F-1000]
U4  W25Q128JVBIQ  [TFBGA_128JVBIQ_WIN]
U5  APS6404L-3SQR-SN  [APS6404L-3SQR-SN_APY]

### Nets
+3V3_DIG: C35.2 C36.2 C37.2 R28.1 R29.1 R31.1 U4.B4(VCC) U5.8(VDD)
GND_SYS: C35.1 C36.1 C37.1 R27.1 U4.B3(GND) U5.4(VSS)
PSRAM_CS_N: R30.1
QSPI_SCLK: U4.B2(CLK) U5.6(SCLK)
QSPI_SD0: U4.D3(DI_(IO0)) U5.5(SI/SIO[0])
QSPI_SD1: U4.D2(DO_(IO1)) U5.2(SO/SIO[1])
QSPI_SD2: U4.C4(/WP_(IO2)) U5.3(SIO[2])
QSPI_SD3: U4.D4(/HOLD_(IO3)) U5.7(SIO[3])
QSPI_SS: R28.2 SW1.1 U4.C2(/CS)
NetR27_2: R27.2 SW1.3
NetR29_2: R29.2 U4.A4(/RESET)
NetR30_2: R30.2 R31.2 U5.1(/CE)

Not connected (* = marked no-connect by the designer): SW1 2* 4*; U4 A2(NC)* A3(NC)* A5(NC)* B1(NC)* B5(NC)* C1(NC)* C3(NC)* C5(NC)* D1(NC)* D5(NC)* E1(NC)* E2(NC)* E3(NC)* E4(NC)* E5(NC)*

### Notes on the sheet
- (near SW1) BOOTSEL
- Перв.примен.
- Справ.№
- Подп. и дата
- Инв.№ дубл.
- Взам.инв.№
- Подп.и дата
- Разраб.
- Изм.
- Лист
- № докум.
- Подп.
- Дата
- Лит.
- Масштаб
- Масса
- Т.контр.
- Пров.
- СХЕМА   ЭЛЕКТРИЧЕСКАЯ
- ПРИНЦИПИАЛЬНАЯ
- Листов
- Инв.№ подл.
- Утв.
- Н.контр.
- Нач.сект.
- Формат  A3

### Library data of the parts
C35-C37 = Capacitor: SimulationGenericComponent: True
R27-R29 R31 = Resistor: TC1: 0; SimulationGenericComponent: True; TC2: 0
R30 = Resistor: SimulationGenericComponent: True; TC1: 0; TC2: 0
SW1 = B3F-1000: Tactile Switch SPST-NO Top Actuated Through Hole; MF: Omron; Price: None; Check_prices: https://www.snapeda.com/parts/B3F-1000/Omron+Electronics+Inc-EMC+Div/view-part/?ref=eda; Purchase-URL: https://pricing.snapeda.com/search/part/B3F-1000/?ref=eda; Value: *; Package: None; Availability: In Stock; MP: B3F-1000; SnapEDA_Link: https://www.snapeda.com/parts/B3F-1000/Omron+Electronics+Inc-EMC+Div/view-part/?ref=snap
U4 = W25Q128JVBIQ: No Description Available; Manufacturer_Name: Winbond; Type: Memory; Copyright: Copyright (C) 2026 Ultra Librarian. All rights reserved.; Manufacturer_Part_Number: W25Q128JVBIQ; RefDes: RefDes
U5 = APS6404L-3SQR-SN: Description; Manufacturer_Name: AP Memory; Copyright: Copyright (C) 2025 Ultra Librarian. All rights reserved.; Manufacturer_Part_Number: APS6404L-3SQR-SN; RefDes: RefDes; Type: Type

## Sheet 05_ETHERNET_USB.SchDoc: Схема электрическая принципиальная
size 420 x 297 mm; ApprovedBy: Скрябин; CheckedBy: Скрябин; Author: Корсунов; CompanyName: РТУ МИРЭА; SheetNumber: 5; SheetTotal: 11; PageSetup: Record=PageOptions|CenterHorizontal=True|CenterVertical=True|PrintScale=0.94|XCorrection=1.00|YCorrection=1.00|PrintKind=1|BorderSize=5000000|LeftOffset=0|BottomOffset=0|Orientation=1|PaperLength=1000|PaperWidth=1000|Scale=100|PaperSource=7|PrintQuality=-4|MediaType=1|DitherType=10|PaperKind=A4|PrintScaleMode=1; DecimalNumber: RP23.000001.005 Э3; Name1: Модуль ввода-вывода; lit_A: О; Name2: RP2350 OPC UA
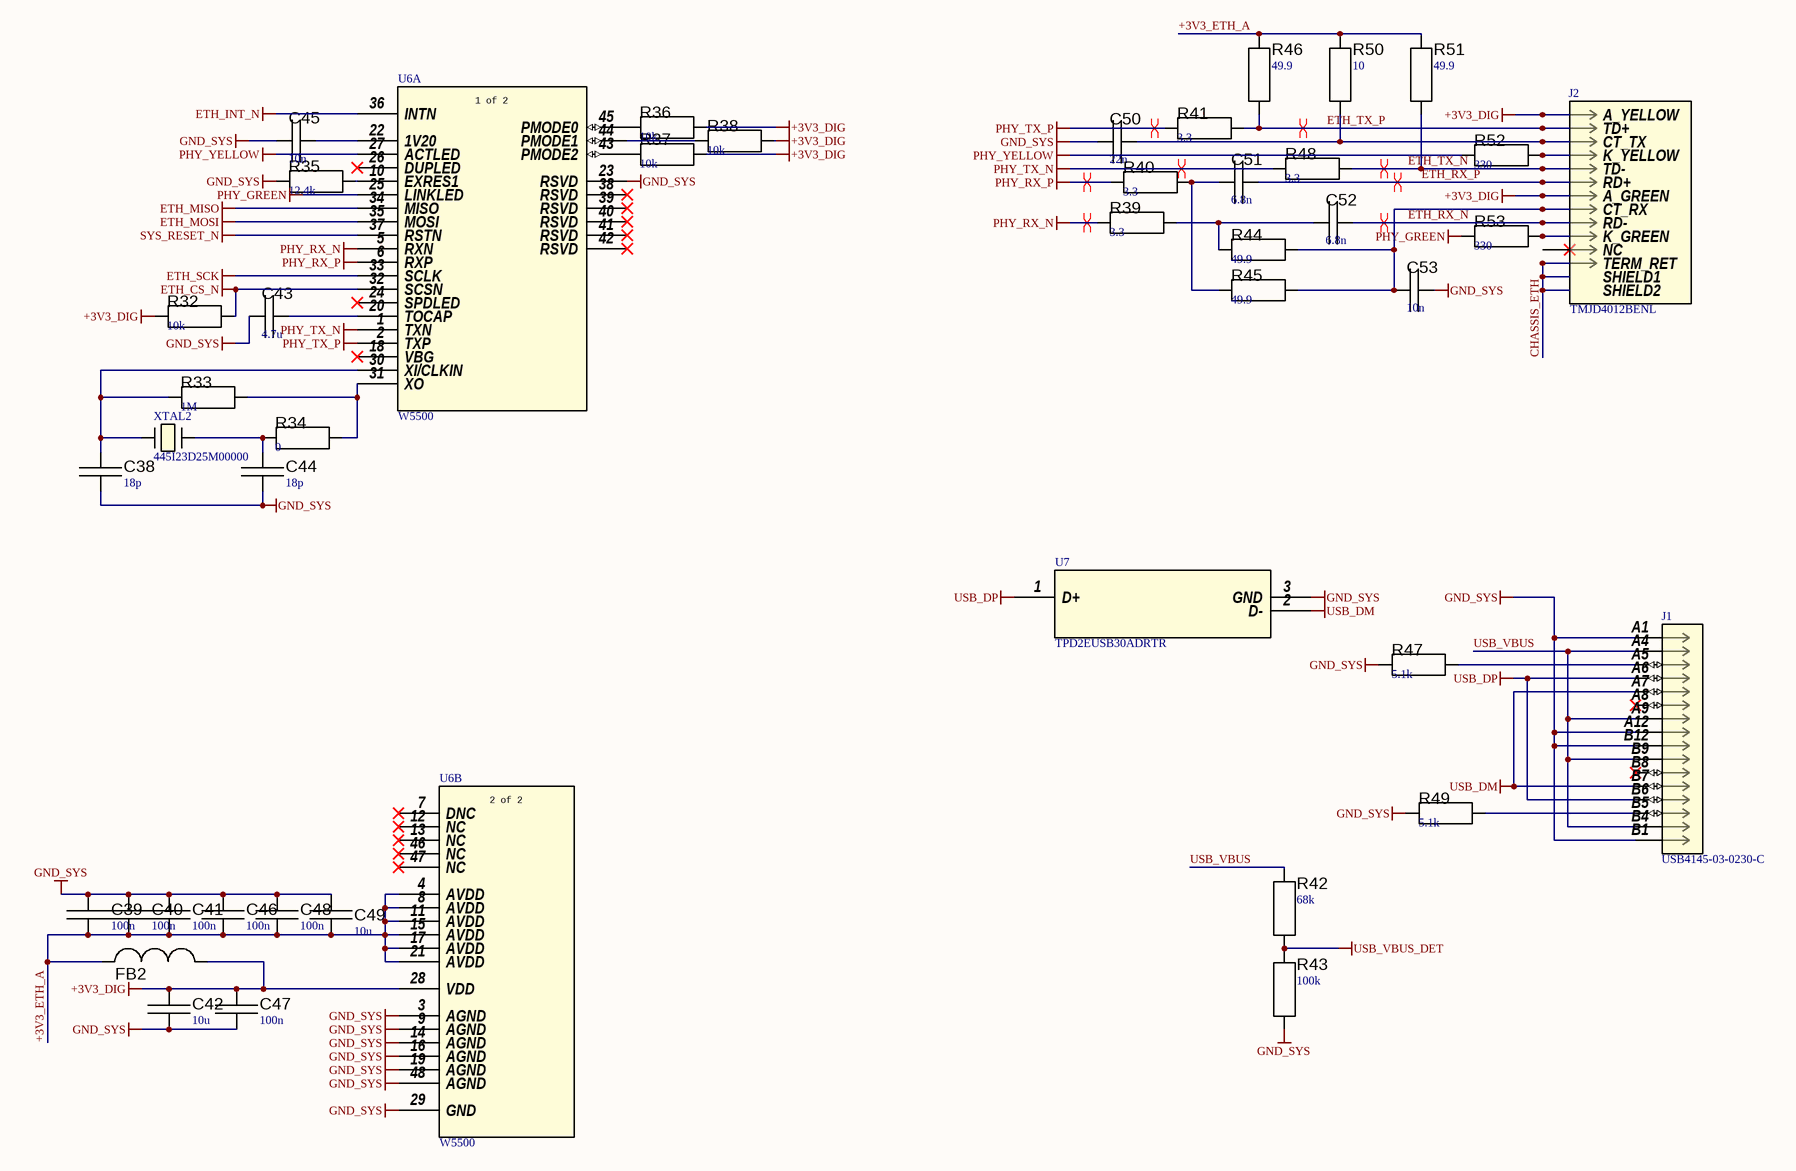
[diagram p4: 05_ETHERNET_USB.SchDoc]

### Parts
C38  value 18p  [C_0603]  (hidden comment: Capacitor)
C39  value 100n  [C_0603]  (hidden comment: Capacitor)
C40  value 100n  [C_0603]  (hidden comment: Capacitor)
C41  value 100n  [C_0603]  (hidden comment: Capacitor)
C42  value 10u  [C_0805]  (hidden comment: Capacitor)
C43  value 4.7u  [C_1206]  (hidden comment: Capacitor)
C44  value 18p  [C_0603]  (hidden comment: Capacitor)
C45  value 10n  [C_0603]  (hidden comment: Capacitor)
C46  value 100n  [C_0603]  (hidden comment: Capacitor)
C47  value 100n  [C_0603]  (hidden comment: Capacitor)
C48  value 100n  [C_0603]  (hidden comment: Capacitor)
C49  value 10u  [C_0805]  (hidden comment: Capacitor)
C50  value 22n  [C_0603]  (hidden comment: Capacitor)
C51  value 6.8n  [C_0603]  (hidden comment: Capacitor)
C52  value 6.8n  [C_0603]  (hidden comment: Capacitor)
C53  value 10n  [C_0603]  (hidden comment: Capacitor)
FB2  120R 100MHz  [L_0805]  (value not drawn)
J1  USB4145-03-0230-C  [CONN_USB4145-03-0230-C_GCT]
J2  TMJD4012BENL  [CONN12_TMJD4012BENL_TAL]
R32  value 10k  [R_0603]  (hidden comment: Resistor)
R33  value 1M  [R_0603]  (hidden comment: Resistor)
R34  value 0  [R_0603]  (hidden comment: Resistor)
R35  value 12.4k  [R_0603]  (hidden comment: Resistor)
R36  value 10k  [R_0603]  (hidden comment: Resistor)
R37  value 10k  [R_0603]  (hidden comment: Resistor)
R38  value 10k  [R_0603]  (hidden comment: Resistor)
R39  value 3.3  [R_0603]  (hidden comment: Resistor)
R40  value 3.3  [R_0603]  (hidden comment: Resistor)
R41  value 3.3  [R_0603]  (hidden comment: Resistor)
R42  value 68k  [R_0603]  (hidden comment: Resistor)
R43  value 100k  [R_0603]  (hidden comment: Resistor)
R44  value 49.9  [R_0603]  (hidden comment: Resistor)
R45  value 49.9  [R_0603]  (hidden comment: Resistor)
R46  value 49.9  [R_0603]  (hidden comment: Resistor)
R47  value 5.1k  [R_0603]  (hidden comment: Resistor)
R48  value 3.3  [R_0603]  (hidden comment: Resistor)
R49  value 5.1k  [R_0603]  (hidden comment: Resistor)
R50  value 10  [R_0603]  (hidden comment: Resistor)
R51  value 49.9  [R_0603]  (hidden comment: Resistor)
R52  value 330  [R_0603]  (hidden comment: Resistor)
R53  value 330  [R_0603]  (hidden comment: Resistor)
U6  W5500  [48LQFP_W5500_WIZ]  (parts A,B of 2)
U7  TPD2EUSB30ADRTR  [DRT3]
XTAL2  445I23D25M00000  [XTAL_445I23D25M00000_CTS]

### Nets
+3V3_DIG: C42.2 C47.2 FB2.2 J2.9(A_YELLOW) J2.11(A_GREEN) R32.1 R36.2 R37.2 R38.2 U6.28(VDD)
ETH_CS_N: R32.2 U6.32(SCSN)
ETH_INT_N: U6.36(INTN)
ETH_MISO: U6.34(MISO)
ETH_MOSI: U6.35(MOSI)
ETH_SCK: U6.33(SCLK)
GND_SYS: C38.1 C39.2 C40.2 C41.2 C42.1 C43.1 C44.1 C45.1 C46.2 C47.1 C48.2 C49.2 C50.1 C53.2 J1.A1(GND) J1.A12(GND) J1.B1(GND) J1.B12(GND) R35.1 R43.1 R47.1 R49.1 U6.3(AGND) U6.9(AGND) U6.14(AGND) U6.16(AGND) U6.19(AGND) U6.23(RSVD) U6.29(GND) U6.48(AGND) U7.3(GND)
PHY_GREEN: R53.1 U6.25(LINKLED)
PHY_RX_N: R39.1 U6.5(RXN)
PHY_RX_P: R40.1 U6.6(RXP)
PHY_TX_N: R48.1 U6.1(TXN)
PHY_TX_P: R41.1 U6.2(TXP)
PHY_YELLOW: R52.1 U6.27(ACTLED)
SYS_RESET_N: U6.37(RSTN)
USB_DM: J1.A7(DN1) J1.B7(DN2) U7.2(D-)
USB_DP: J1.A6(DP1) J1.B6(DP2) U7.1(D+)
USB_VBUS_DET: R42.1 R43.2
+3V3_ETH_A: C39.1 C40.1 C41.1 C46.1 C48.1 C49.1 FB2.1 R46.2 R50.2 R51.2 U6.4(AVDD) U6.8(AVDD) U6.11(AVDD) U6.15(AVDD) U6.17(AVDD) U6.21(AVDD)
CHASSIS_ETH: J2.8(TERM_RET) J2.14(SHIELD1) J2.16(SHIELD2)
ETH_RX_N: C52.2 J2.6(RD-)
ETH_RX_P: C51.2 J2.4(RD+)
ETH_TX_N: J2.3(TD-) R48.2 R51.1
ETH_TX_P: J2.1(TD+) R41.2 R46.1
USB_VBUS: J1.A4(VBUS) J1.A9(VBUS) J1.B4(VBUS) J1.B9(VBUS) R42.2
NetC38_2: C38.2 R33.1 U6.30(XI/CLKIN) XTAL2.1
NetC43_2: C43.2 U6.20(TOCAP)
NetC44_2: C44.2 R34.1 XTAL2.2
NetC45_2: C45.2 U6.22(1V20)
NetC50_2: C50.2 J2.2(CT_TX) R50.1
NetC51_1: C51.1 R40.2 R45.1
NetC52_1: C52.1 R39.2 R44.1
NetC53_1: C53.1 J2.5(CT_RX) R44.2 R45.2
NetJ1_A5: J1.A5(CC1) R47.2
NetJ1_B5: J1.B5(CC2) R49.2
NetJ2_10: J2.10(K_YELLOW) R52.2
NetJ2_12: J2.12(K_GREEN) R53.2
NetR33_2: R33.2 R34.2 U6.31(XO)
NetR35_2: R35.2 U6.10(EXRES1)
NetR36_1: R36.1 U6.45(PMODE0)
NetR37_1: R37.1 U6.43(PMODE2)
NetR38_1: R38.1 U6.44(PMODE1)

Not connected (* = marked no-connect by the designer): J1 A8(SBU1)* B8(SBU2)*; J2 7(NC); U6 7(DNC)* 12(NC)* 13(NC)* 18(VBG)* 24(SPDLED)* 26(DUPLED)* 38(RSVD)* 39(RSVD)* 40(RSVD)* 41(RSVD)* 42(RSVD)* 46(NC)* 47(NC)*

### Layout directives
differential pair: ETH_RX_N, ETH_RX_P, ETH_TX_N, ETH_TX_P, PHY_RX_N, PHY_RX_P, PHY_TX_N, PHY_TX_P

### Notes on the sheet
- Перв.примен.
- Справ.№
- Подп. и дата
- Инв.№ дубл.
- Взам.инв.№
- Подп.и дата
- Разраб.
- Изм.
- Лист
- № докум.
- Подп.
- Дата
- Лит.
- Масштаб
- Масса
- Т.контр.
- Пров.
- СХЕМА   ЭЛЕКТРИЧЕСКАЯ
- ПРИНЦИПИАЛЬНАЯ
- Листов
- Инв.№ подл.
- Утв.
- Н.контр.
- Нач.сект.
- Формат  A3
- (in symbol W5500, part A) 1 of 2
- (in symbol W5500, part B) 2 of 2

### Library data of the parts
C38-C53 = Capacitor: SimulationGenericComponent: True
FB2 = Ferrite Chip: SMT Ferrite Chip
J1 = USB4145-03-0230-C: Description; Manufacturer_Name: Global Connector Technology; Copyright: Copyright (C) 2026 Ultra Librarian. All rights reserved.; Manufacturer_Part_Number: USB4145-03-0230-C; RefDes: RefDes; Type: Type
J2 = TMJD4012BENL: No Description Available; Manufacturer_Name: Taoglas Limited; Type: Modular Connector Jacks With Magnetics; Copyright: Copyright (C) 2026 Ultra Librarian. All rights reserved.; Manufacturer_Part_Number: TMJD4012BENL; RefDes: RefDes
R32 R33 R35-R53 = Resistor: TC1: 0; SimulationGenericComponent: True; TC2: 0
R34 = Resistor: SimulationGenericComponent: True; TC1: 0; TC2: 0
U6 = W5500: Description; Manufacturer_Name: WIZnet; Copyright: Copyright (C) 2025 Ultra Librarian. All rights reserved.; Manufacturer_Part_Number: W5500; RefDes: RefDes; Type: Type
U7 = TPD2EUSB30ADRTR: Dual 0.7-pF, 3.6-V, &plusmn;8-kV ESD protection diode with 5-A surge rating for USB 3.0 3-SOT-9X3 -40 to 85; Manufacturer_Name: Texas Instruments; Copyright: Copyright (C) 2026 Ultra Librarian. All rights reserved.; Manufacturer_Part_Number: TPD2EUSB30ADRTR; RefDes: RefDes; Type: Type
XTAL2 = 445I23D25M00000: Description; Manufacturer_Name: CTS Components; Copyright: Copyright (C) 2025 Ultra Librarian. All rights reserved.; Manufacturer_Part_Number: 445I23D25M00000

## Sheet 06_RS485.SchDoc: Схема электрическая принципиальная
size 420 x 297 mm; ApprovedBy: Скрябин; CheckedBy: Скрябин; Author: Корсунов; CompanyName: РТУ МИРЭА; SheetNumber: 6; SheetTotal: 11; PageSetup: Record=PageOptions|CenterHorizontal=True|CenterVertical=True|PrintScale=0.94|XCorrection=1.00|YCorrection=1.00|PrintKind=1|BorderSize=5000000|LeftOffset=0|BottomOffset=0|Orientation=1|PaperLength=1000|PaperWidth=1000|Scale=100|PaperSource=7|PrintQuality=-4|MediaType=1|DitherType=10|PaperKind=A4|PrintScaleMode=1; DecimalNumber: RP23.000001.006 Э3; Name1: Модуль ввода-вывода; lit_A: О; Name2: RP2350 OPC UA
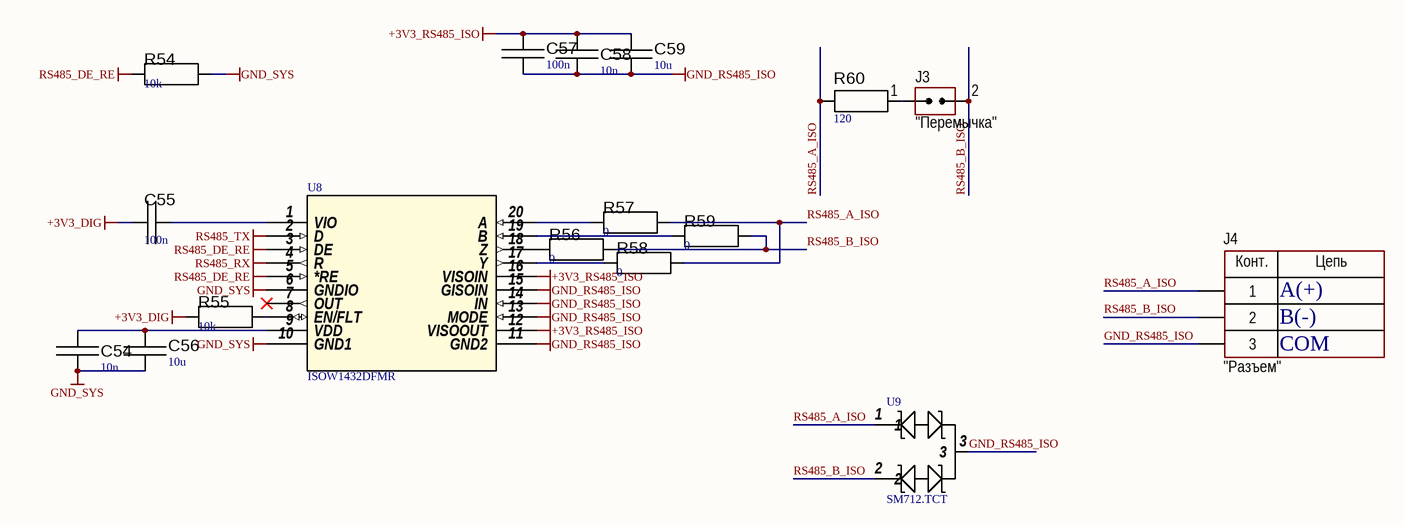
[diagram p5: 06_RS485.SchDoc]

### Parts
C54  value 10n  [C_0603]  (hidden comment: Capacitor)
C55  value 100n  [C_0603]  (hidden comment: Capacitor)
C56  value 10u  [C_0805]  (hidden comment: Capacitor)
C57  value 100n  [C_0603]  (hidden comment: Capacitor)
C58  value 10n  [C_0603]  (hidden comment: Capacitor)
C59  value 10u  [C_0805]  (hidden comment: Capacitor)
J3  CommentText: "Перемычка"  [CON: JUMPER x1]
J4  CommentText: "Разъем"  [CON: DG350-3.5-03P]
R54  value 10k  [R_0603]  (hidden comment: Resistor)
R55  value 10k  [R_0603]  (hidden comment: Resistor)
R56  value 0  [R_0603]  (hidden comment: Resistor)
R57  value 0  [R_0603]  (hidden comment: Resistor)
R58  value 0  [R_0603]  (hidden comment: Resistor)
R59  value 0  [R_0603]  (hidden comment: Resistor)
R60  value 120  [R_0603]  (hidden comment: Resistor)
U8  ISOW1432DFMR  [SOIC_2DFM_TEX]
U9  SM712.TCT  [SOT23_SEM]

### Nets
+3V3_DIG: C55.1 R55.1
+3V3_RS485_ISO: C57.1 C58.2 C59.2 U8.12(VISOOUT) U8.16(VISOIN)
GND_RS485_ISO: C57.2 C58.1 C59.1 J4.3 U8.11(GND2) U8.13(MODE) U8.14(IN) U8.15(GISOIN) U9.3
GND_SYS: C54.1 C56.1 R54.2 U8.6(GNDIO) U8.10(GND1)
RS485_DE_RE: R54.1 U8.3(DE) U8.5(*RE)
RS485_RX: U8.4(R)
RS485_TX: U8.2(D)
RS485_A_ISO: J4.1 R57.2 R58.2 R60.2 U9.1
RS485_B_ISO: J3.2(IN) J4.2 R56.2 R59.2 U9.2
NetC54_2: C54.2 C56.2 U8.9(VDD)
NetC55_2: C55.2 U8.1(VIO)
NetJ3_1: J3.1(IN) R60.1
NetR55_2: R55.2 U8.8(EN/FLT)
NetR56_1: R56.1 U8.18(Z)
NetR57_1: R57.1 U8.20(A)
NetR58_1: R58.1 U8.17(Y)
NetR59_1: R59.1 U8.19(B)

Not connected (* = marked no-connect by the designer): U8 7(OUT)*

### Notes on the sheet
- A(+)
- B(-)
- COM
- Перв.примен.
- Справ.№
- Подп. и дата
- Инв.№ дубл.
- Взам.инв.№
- Подп.и дата
- Разраб.
- Изм.
- Лист
- № докум.
- Подп.
- Дата
- Лит.
- Масштаб
- Масса
- Т.контр.
- Пров.
- СХЕМА   ЭЛЕКТРИЧЕСКАЯ
- ПРИНЦИПИАЛЬНАЯ
- Листов
- Инв.№ подл.
- Утв.
- Н.контр.
- Нач.сект.
- Формат  A3
- (in symbol Connector_terminal_3pin) Конт.; Цепь

### Library data of the parts
C54-C59 = Capacitor: SimulationGenericComponent: True
J3 = Jumper_single
J4 = Connector_terminal_3pin: Manufacturer: Degson; ValueManufacturerPartNumber: Terminal connector, 3pin, 3.5mm, 300VAC, 10A; PartNumber: DG350-3.5-03P-14; TypeConnector: Terminal connector; VoltageMax: 300VAC; Pitch: 3.5mm; CurrentMax: 10A; Multichannel: 3pin; HelpURL: https://www.chipdip.ru/product/dg350-3.5-03p-12
R54 R55 R60 = Resistor: TC1: 0; SimulationGenericComponent: True; TC2: 0
R56-R59 = Resistor: SimulationGenericComponent: True; TC1: 0; TC2: 0
U8 = ISOW1432DFMR: Low emissions, 5-kVrms, 12-Mbps isolated RS-485 transceiver with integrated DC/DC converter 20-SOIC -40 to 125; Manufacturer_Name: Texas Instruments; Type: Digital Isolators; Copyright: Copyright (C) 2026 Ultra Librarian. All rights reserved.; Manufacturer_Part_Number: ISOW1432DFMR; RefDes: RefDes
U9 = SM712.TCT: Description; Manufacturer_Name: Semtech; Copyright: Copyright (C) 2025 Ultra Librarian. All rights reserved.; Manufacturer_Part_Number: SM712.TCT

## Sheet 07_ANALOG_INPUTS.SchDoc: Схема электрическая принципиальная
size 420 x 297 mm; ApprovedBy: Скрябин; CheckedBy: Скрябин; Author: Корсунов; CompanyName: РТУ МИРЭА; SheetNumber: 7; SheetTotal: 11; PageSetup: Record=PageOptions|CenterHorizontal=True|CenterVertical=True|PrintScale=0.94|XCorrection=1.00|YCorrection=1.00|PrintKind=1|BorderSize=5000000|LeftOffset=0|BottomOffset=0|Orientation=1|PaperLength=1000|PaperWidth=1000|Scale=100|PaperSource=7|PrintQuality=-4|MediaType=1|DitherType=10|PaperKind=A4|PrintScaleMode=1; DecimalNumber: RP23.000001.007 Э3; Name1: Модуль ввода-вывода; lit_A: О; Name2: RP2350 OPC UA
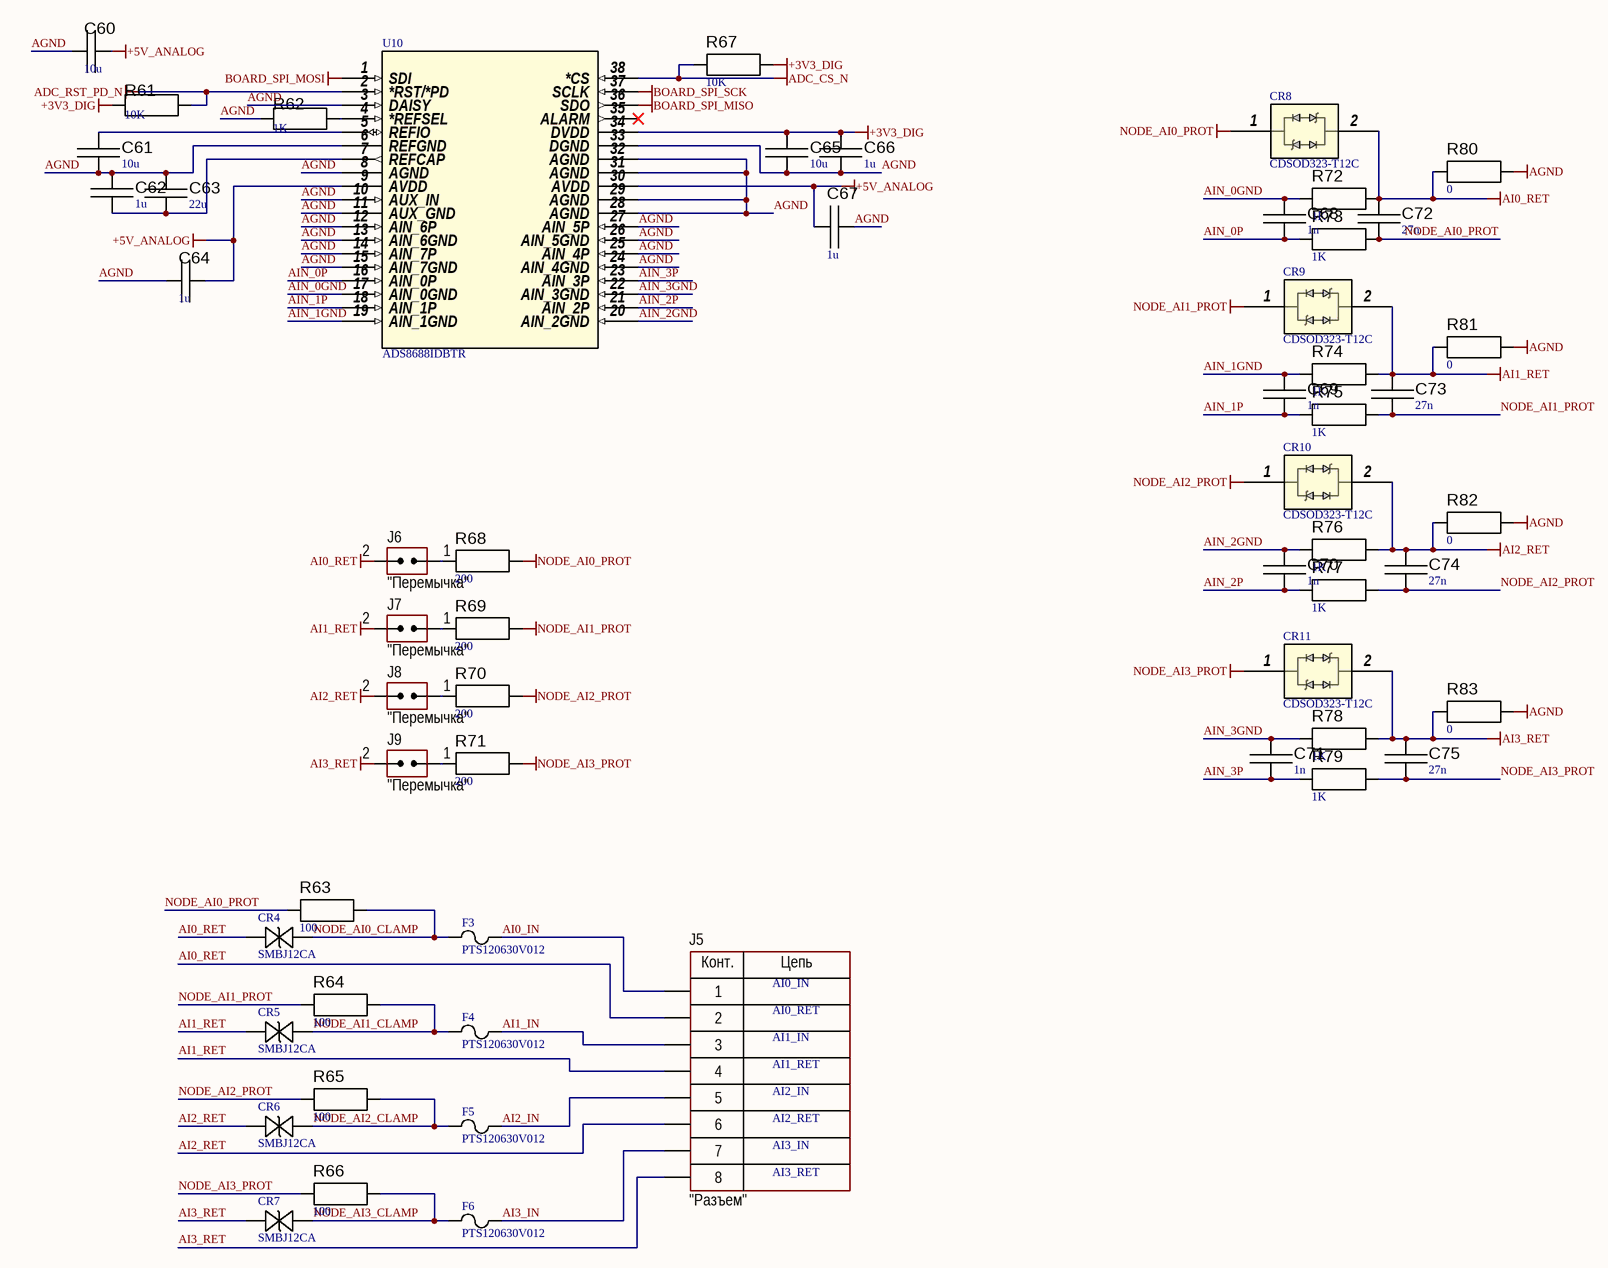
[diagram p6: 07_ANALOG_INPUTS.SchDoc]

### Parts
C60  value 10u  [C_1206]  (hidden comment: Capacitor)
C61  value 10u  [C_1206]  (hidden comment: Capacitor)
C62  value 1u  [C_0603]  (hidden comment: Capacitor)
C63  value 22u  [C_1210]  (hidden comment: Capacitor)
C64  value 1u  [C_0603]  (hidden comment: Capacitor)
C65  value 10u  [C_1206]  (hidden comment: Capacitor)
C66  value 1u  [C_0603]  (hidden comment: Capacitor)
C67  value 1u  [C_0603]  (hidden comment: Capacitor)
C68  value 1n  [C_0603]  (hidden comment: Capacitor)
C69  value 1n  [C_0603]  (hidden comment: Capacitor)
C70  value 1n  [C_0603]  (hidden comment: Capacitor)
C71  value 1n  [C_0603]  (hidden comment: Capacitor)
C72  value 27n  [C_0603]  (hidden comment: Capacitor)
C73  value 27n  [C_0603]  (hidden comment: Capacitor)
C74  value 27n  [C_0603]  (hidden comment: Capacitor)
C75  value 27n  [C_0603]  (hidden comment: Capacitor)
CR4  SMBJ12CA  [SMBJSeries_LTF]
CR5  SMBJ12CA  [SMBJSeries_LTF]
CR6  SMBJ12CA  [SMBJSeries_LTF]
CR7  SMBJ12CA  [SMBJSeries_LTF]
CR8  CDSOD323-T12C  [CDSOD_BIDI_BRN]
CR9  CDSOD323-T12C  [CDSOD_BIDI_BRN]
CR10  CDSOD323-T12C  [CDSOD_BIDI_BRN]
CR11  CDSOD323-T12C  [CDSOD_BIDI_BRN]
F3  PTS120630V012  [FUSE_PTS1206_EAT]
F4  PTS120630V012  [FUSE_PTS1206_EAT]
F5  PTS120630V012  [FUSE_PTS1206_EAT]
F6  PTS120630V012  [FUSE_PTS1206_EAT]
J5  CommentText: "Разъем"  [CON: 15EDGRC-3.5-08 (or 691322110008)]
J6  CommentText: "Перемычка"  [CON: JUMPER x1]
J7  CommentText: "Перемычка"  [CON: JUMPER x1]
J8  CommentText: "Перемычка"  [CON: JUMPER x1]
J9  CommentText: "Перемычка"  [CON: JUMPER x1]
R61  value 10K  [R_0603]  (hidden comment: Resistor)
R62  value 1K  [R_0603]  (hidden comment: Resistor)
R63  value 100  [R_0603]  (hidden comment: Resistor)
R64  value 100  [R_0603]  (hidden comment: Resistor)
R65  value 100  [R_0603]  (hidden comment: Resistor)
R66  value 100  [R_0603]  (hidden comment: Resistor)
R67  value 10K  [R_0603]  (hidden comment: Resistor)
R68  value 200  [R_0603]  (hidden comment: Resistor)
R69  value 200  [R_0603]  (hidden comment: Resistor)
R70  value 200  [R_0603]  (hidden comment: Resistor)
R71  value 200  [R_0603]  (hidden comment: Resistor)
R72  value 1K  [R_0603]  (hidden comment: Resistor)
R73  value 1K  [R_0603]  (hidden comment: Resistor)
R74  value 1K  [R_0603]  (hidden comment: Resistor)
R75  value 1K  [R_0603]  (hidden comment: Resistor)
R76  value 1K  [R_0603]  (hidden comment: Resistor)
R77  value 1K  [R_0603]  (hidden comment: Resistor)
R78  value 1K  [R_0603]  (hidden comment: Resistor)
R79  value 1K  [R_0603]  (hidden comment: Resistor)
R80  value 0  [R_0603]  (hidden comment: Resistor)
R81  value 0  [R_0603]  (hidden comment: Resistor)
R82  value 0  [R_0603]  (hidden comment: Resistor)
R83  value 0  [R_0603]  (hidden comment: Resistor)
U10  ADS8688IDBTR  [DBT38_TEX]

### Nets
+3V3_DIG: C65.2 C66.2 R61.1 R67.1 U10.34(DVDD)
+5V_ANALOG: C60.2 C64.2 C67.2 U10.9(AVDD) U10.30(AVDD)
ADC_CS_N: R67.2 U10.38(*CS)
ADC_RST_PD_N: R61.2 U10.2(*RST/*PD)
AGND: C60.1 C61.1 C62.1 C63.2 C64.1 C65.1 C66.1 C67.1 R62.1 R80.1 R81.1 R82.1 R83.1 U10.3(DAISY) U10.6(REFGND) U10.8(AGND) U10.10(AUX_IN) U10.11(AUX_GND) U10.12(AIN_6P) U10.13(AIN_6GND) U10.14(AIN_7P) U10.15(AIN_7GND) U10.24(AIN_4GND) U10.25(AIN_4P) U10.26(AIN_5GND) U10.27(AIN_5P) U10.28(AGND) U10.29(AGND) U10.31(AGND) U10.32(AGND) U10.33(DGND)
AI0_RET: C72.1 CR4.2 CR8.2 J5.2 J6.2(IN) R72.1 R80.2
AI1_RET: C73.1 CR5.2 CR9.2 J5.4 J7.2(IN) R74.1 R81.2
AI2_RET: C74.1 CR6.2 CR10.2 J5.6 J8.2(IN) R76.1 R82.2
AI3_RET: C75.1 CR7.2 CR11.2 J5.8 J9.2(IN) R78.1 R83.2
BOARD_SPI_MISO: U10.36(SDO)
BOARD_SPI_MOSI: U10.1(SDI)
BOARD_SPI_SCK: U10.37(SCLK)
NODE_AI0_PROT: C72.2 CR8.1 R63.2 R68.1 R73.1
NODE_AI1_PROT: C73.2 CR9.1 R64.2 R69.1 R75.1
NODE_AI2_PROT: C74.2 CR10.1 R65.2 R70.1 R77.1
NODE_AI3_PROT: C75.2 CR11.1 R66.2 R71.1 R79.1
AI0_IN: F3.2 J5.1
AI1_IN: F4.2 J5.3
AI2_IN: F5.2 J5.5
AI3_IN: F6.2 J5.7
AIN_0GND: C68.1 R72.2 U10.17(AIN_0GND)
AIN_0P: C68.2 R73.2 U10.16(AIN_0P)
AIN_1GND: C69.1 R74.2 U10.19(AIN_1GND)
AIN_1P: C69.2 R75.2 U10.18(AIN_1P)
AIN_2GND: C70.1 R76.2 U10.20(AIN_2GND)
AIN_2P: C70.2 R77.2 U10.21(AIN_2P)
AIN_3GND: C71.1 R78.2 U10.22(AIN_3GND)
AIN_3P: C71.2 R79.2 U10.23(AIN_3P)
NODE_AI0_CLAMP: CR4.1 F3.1 R63.1
NODE_AI1_CLAMP: CR5.1 F4.1 R64.1
NODE_AI2_CLAMP: CR6.1 F5.1 R65.1
NODE_AI3_CLAMP: CR7.1 F6.1 R66.1
NetC61_2: C61.2 U10.5(REFIO)
NetC62_2: C62.2 C63.1 U10.7(REFCAP)
NetJ6_1: J6.1(IN) R68.2
NetJ7_1: J7.1(IN) R69.2
NetJ8_1: J8.1(IN) R70.2
NetJ9_1: J9.1(IN) R71.2
NetR62_2: R62.2 U10.4(*REFSEL)

Not connected (* = marked no-connect by the designer): U10 35(ALARM)*

### Notes on the sheet
- AI0_IN
- AI0_RET
- AI1_IN
- AI1_RET
- AI2_IN
- AI2_RET
- AI3_IN
- AI3_RET
- Перв.примен.
- Справ.№
- Подп. и дата
- Инв.№ дубл.
- Взам.инв.№
- Подп.и дата
- Разраб.
- Изм.
- Лист
- № докум.
- Подп.
- Дата
- Лит.
- Масштаб
- Масса
- Т.контр.
- Пров.
- СХЕМА   ЭЛЕКТРИЧЕСКАЯ
- ПРИНЦИПИАЛЬНАЯ
- Листов
- Инв.№ подл.
- Утв.
- Н.контр.
- Нач.сект.
- Формат  A3
- (in symbol Connector_terminal_8pin) Конт.; Цепь

### Library data of the parts
C60-C75 = Capacitor: SimulationGenericComponent: True
CR4-CR7 = SMBJ12CA: No Description Available; Manufacturer_Name: Littelfuse Inc; Copyright: Copyright (C) 2026 Ultra Librarian. All rights reserved.; Manufacturer_Part_Number: SMBJ12CA
CR8-CR11 = CDSOD323-T12C: No Description Available; Manufacturer_Name: Bourns Electronics; Copyright: Copyright (C) 2026 Ultra Librarian. All rights reserved.; Manufacturer_Part_Number: CDSOD323-T12C; RefDes: RefDes; Type: Type
F3-F6 = PTS120630V012: No Description Available; Manufacturer_Name: Eaton; Copyright: Copyright (C) 2026 Ultra Librarian. All rights reserved.; Manufacturer_Part_Number: PTS120630V012
J5 = Connector_terminal_8pin: Manufacturer: Degson; ValueManufacturerPartNumber: Terminal connector, 6pin, 3.5mm, 300VAC, 10A; PartNumber: DG350-3.5-08P-14; TypeConnector: Terminal connector; VoltageMax: 300VAC; Pitch: 3.5mm; CurrentMax: 10A; Multichannel: 6pin; HelpURL: https://www.compel.ru/infosheet/DEGSON/DG350-3.5-08P-14-00AH
J6-J9 = Jumper_single
R61-R79 = Resistor: TC1: 0; SimulationGenericComponent: True; TC2: 0
R80-R83 = Resistor: SimulationGenericComponent: True; TC1: 0; TC2: 0
U10 = ADS8688IDBTR: 16-bit, 500kSPS 8-channel single-supply SAR ADC with bipolar input ranges 38-TSSOP -40 to 125; Manufacturer_Name: Texas Instruments; Copyright: Copyright (C) 2026 Ultra Librarian. All rights reserved.; Manufacturer_Part_Number: ADS8688IDBTR; RefDes: RefDes; Type: Type

## Sheet 08_ANALOG_OUTPUTS.SchDoc: Схема электрическая принципиальная
size 420 x 297 mm; ApprovedBy: Скрябин; CheckedBy: Скрябин; Author: Корсунов; CompanyName: РТУ МИРЭА; SheetNumber: 8; SheetTotal: 11; PageSetup: Record=PageOptions|CenterHorizontal=True|CenterVertical=True|PrintScale=0.94|XCorrection=1.00|YCorrection=1.00|PrintKind=1|BorderSize=5000000|LeftOffset=0|BottomOffset=0|Orientation=1|PaperLength=1000|PaperWidth=1000|Scale=100|PaperSource=7|PrintQuality=-4|MediaType=1|DitherType=10|PaperKind=A4|PrintScaleMode=1; DecimalNumber: RP23.000001.008 Э3; Name1: Модуль ввода-вывода; lit_A: О; Name2: RP2350 OPC UA
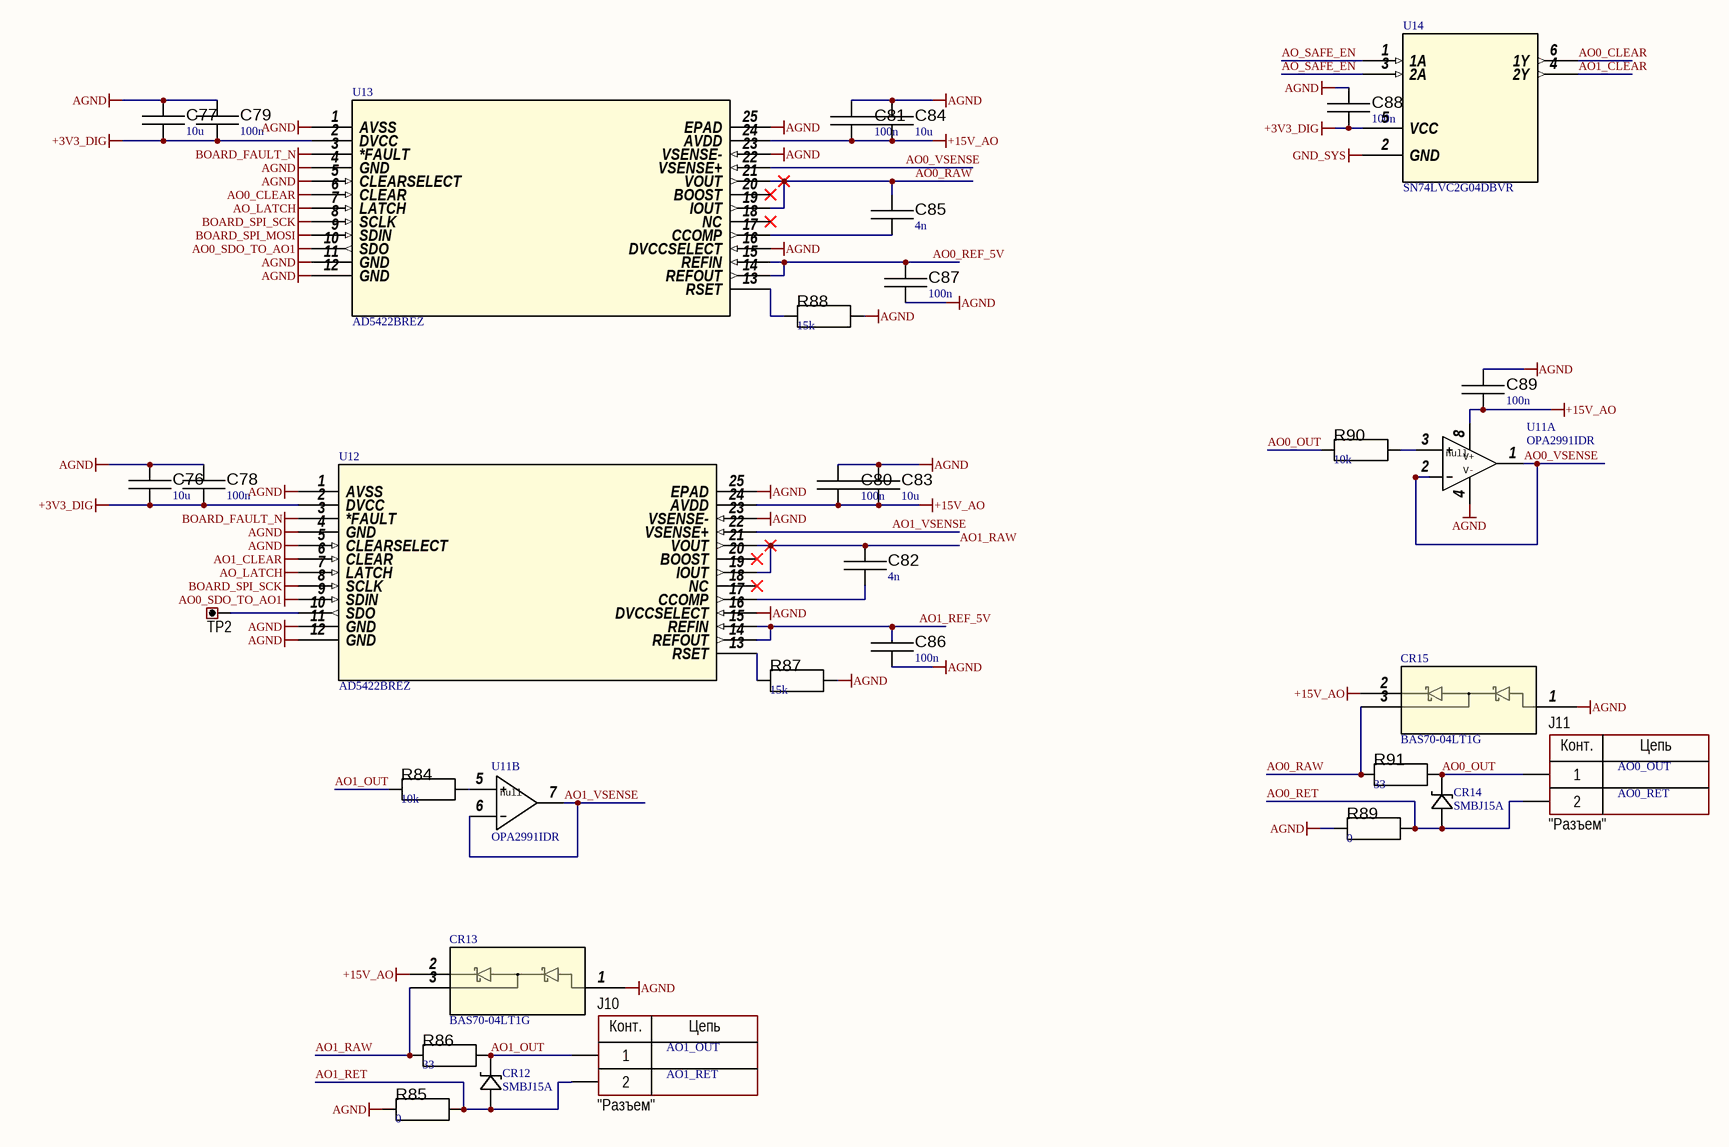
[diagram p7: 08_ANALOG_OUTPUTS.SchDoc]

### Parts
C76  value 10u  [C_0805]  (hidden comment: Capacitor)
C77  value 10u  [C_0805]  (hidden comment: Capacitor)
C78  value 100n  [C_0603]  (hidden comment: Capacitor)
C79  value 100n  [C_0603]  (hidden comment: Capacitor)
C80  value 100n  [C_0805]  (hidden comment: Capacitor)
C81  value 100n  [C_0805]  (hidden comment: Capacitor)
C82  value 4n  [C_0603]  (hidden comment: Capacitor)
C83  value 10u  [C_1206]  (hidden comment: Capacitor)
C84  value 10u  [C_1206]  (hidden comment: Capacitor)
C85  value 4n  [C_0603]  (hidden comment: Capacitor)
C86  value 100n  [C_0603]  (hidden comment: Capacitor)
C87  value 100n  [C_0603]  (hidden comment: Capacitor)
C88  value 100n  [C_0603]  (hidden comment: Capacitor)
C89  value 100n  [C_0805]  (hidden comment: Capacitor)
CR12  SMBJ15A  [DO-214AASMB_J-BEND_LTF]
CR13  BAS70-04LT1G  [SOT-23TO-236_318-08_ONS]
CR14  SMBJ15A  [DO-214AASMB_J-BEND_LTF]
CR15  BAS70-04LT1G  [SOT-23TO-236_318-08_ONS]
J10  CommentText: "Разъем"  [CON: DG350-3.5-02P]
J11  CommentText: "Разъем"  [CON: DG350-3.5-02P]
R84  value 10k  [R_0603]  (hidden comment: Resistor)
R85  value 0  [R_0603]  (hidden comment: Resistor)
R86  value 33  [R_0603]  (hidden comment: Resistor)
R87  value 15k  [R_0603]  (hidden comment: Resistor)
R88  value 15k  [R_0603]  (hidden comment: Resistor)
R89  value 0  [R_0603]  (hidden comment: Resistor)
R90  value 10k  [R_0603]  (hidden comment: Resistor)
R91  value 33  [R_0603]  (hidden comment: Resistor)
TP2  (no value)  [CON: 5000 (Keystone)]
U11  OPA2991IDR  [D0008A-IPC_A]  (parts A,B of 2)
U12  AD5422BREZ  [RE_24_ADI]
U13  AD5422BREZ  [RE_24_ADI]
U14  SN74LVC2G04DBVR  [DBV6]

### Nets
+3V3_DIG: C76.2 C77.2 C78.2 C79.2 C88.2 U12.2(DVCC) U13.2(DVCC) U14.5(VCC)
+15V_AO: C80.1 C81.1 C83.1 C84.1 C89.1 CR13.2 CR15.2 U11.8(V+) U12.24(AVDD) U13.24(AVDD)
AGND: C76.1 C77.1 C78.1 C79.1 C80.2 C81.2 C83.2 C84.2 C86.1 C87.1 C88.1 C89.2 CR13.1 CR15.1 R85.1 R87.2 R88.2 R89.1 U11.4(V-) U12.1(AVSS) U12.4(GND) U12.5(CLEARSELECT) U12.11(GND) U12.12(GND) U12.16(DVCCSELECT) U12.23(VSENSE-) U12.25(EPAD) U13.1(AVSS) U13.4(GND) U13.5(CLEARSELECT) U13.11(GND) U13.12(GND) U13.16(DVCCSELECT) U13.23(VSENSE-) U13.25(EPAD)
AO0_CLEAR: U13.6(CLEAR) U14.6(1Y)
AO0_SDO_TO_AO1: U12.9(SDIN) U13.10(SDO)
AO1_CLEAR: U12.6(CLEAR) U14.4(2Y)
AO_LATCH: U12.7(LATCH) U13.7(LATCH)
AO_SAFE_EN: U14.1(1A) U14.3(2A)
BOARD_FAULT_N: U12.3(*FAULT) U13.3(*FAULT)
BOARD_SPI_MOSI: U13.9(SDIN)
BOARD_SPI_SCK: U12.8(SCLK) U13.8(SCLK)
GND_SYS: U14.2(GND)
AO0_OUT: CR14.1 J11.1 R90.1 R91.2
AO0_RAW: C85.1 CR15.3 R91.1 U13.19(IOUT) U13.21(VOUT)
AO0_REF_5V: C87.2 U13.14(REFOUT) U13.15(REFIN)
AO0_RET: CR14.2 J11.2 R89.2
AO0_VSENSE: U11.1(OUT1) U11.2(IN1-) U13.22(VSENSE+)
AO1_OUT: CR12.1 J10.1 R84.1 R86.2
AO1_RAW: C82.1 CR13.3 R86.1 U12.19(IOUT) U12.21(VOUT)
AO1_REF_5V: C86.2 U12.14(REFOUT) U12.15(REFIN)
AO1_RET: CR12.2 J10.2 R85.2
AO1_VSENSE: U11.6(IN2-) U11.7(OUT2) U12.22(VSENSE+)
NetC82_2: C82.2 U12.17(CCOMP)
NetC85_2: C85.2 U13.17(CCOMP)
NetR84_2: R84.2 U11.5(IN2+)
NetR87_1: R87.1 U12.13(RSET)
NetR88_1: R88.1 U13.13(RSET)
NetR90_2: R90.2 U11.3(IN1+)
NetTP2_1: TP2.1 U12.10(SDO)

Not connected (* = marked no-connect by the designer): U12 18(NC)* 20(BOOST)*; U13 18(NC)* 20(BOOST)*

### Notes on the sheet
- AO0_OUT
- AO0_RET
- AO1_OUT
- AO1_RET
- Перв.примен.
- Справ.№
- Подп. и дата
- Инв.№ дубл.
- Взам.инв.№
- Подп.и дата
- Разраб.
- Изм.
- Лист
- № докум.
- Подп.
- Дата
- Лит.
- Масштаб
- Масса
- Т.контр.
- Пров.
- СХЕМА   ЭЛЕКТРИЧЕСКАЯ
- ПРИНЦИПИАЛЬНАЯ
- Листов
- Инв.№ подл.
- Утв.
- Н.контр.
- Нач.сект.
- Формат  A3
- (in symbol Connector_terminal_2pin) Конт.; Цепь
- (in symbol OPA2991IDR, part A) null
- (in symbol OPA2991IDR, part B) null

### Library data of the parts
C76-C89 = Capacitor: SimulationGenericComponent: True
CR12 CR14 = SMBJ15A: Description; Manufacturer_Name: Littelfuse Inc; Copyright: Copyright (C) 2025 Ultra Librarian. All rights reserved.; Manufacturer_Part_Number: SMBJ15A
CR13 CR15 = BAS70-04LT1G: No Description Available; Manufacturer_Name: onsemi; Copyright: Copyright (C) 2026 Ultra Librarian. All rights reserved.; Manufacturer_Part_Number: BAS70-04LT1G; RefDes: RefDes; Type: Type
J10 J11 = Connector_terminal_2pin: as X1 on sheet 01_POWER_INPUT; HelpURL: https://www.chipdip.ru/product/dg350-3.5-02p-12
R84 R86-R88 R90 R91 = Resistor: TC1: 0; SimulationGenericComponent: True; TC2: 0
R85 R89 = Resistor: SimulationGenericComponent: True; TC1: 0; TC2: 0
TP2 = Connector_Test_Point: as TP1 on sheet 01_POWER_INPUT; HelpURL: https://www.digikey.com/product-detail/en/keystone-electronics/5001/36-5001-ND/255327
U11 = OPA2991IDR: Dual, 40-V, 4.5-MHz, low-power operational amplifier 8-SOIC -40 to 125; Manufacturer_Name: Texas Instruments; TYPE: TYPE; RefDes: RefDes; Copyright: Copyright (C) 2025 Ultra Librarian. All rights reserved.; Manufacturer_Part_Number: OPA2991IDR
U12 U13 = AD5422BREZ: Single Channel, 16-Bit, Current Source & Voltage Output DAC, HART Connectivity; Manufacturer_Name: Analog Devices Inc; Copyright: Copyright (C) 2026 Ultra Librarian. All rights reserved.; Manufacturer_Part_Number: AD5422BREZ; Datasheet: https://www.analog.com/media/en/technical-documentation/data-sheets/AD5412_5422.pdf; RefDes: RefDes; Type: Type
U14 = SN74LVC2G04DBVR: 2-ch, 1.65-V to 5.5-V inverters 6-SOT-23 -40 to 125; Manufacturer_Name: Texas Instruments; Copyright: Copyright (C) 2025 Ultra Librarian. All rights reserved.; Manufacturer_Part_Number: SN74LVC2G04DBVR; RefDes: RefDes; Type: Type